# EAGLE schematic 6502_nes_book (EAGLE 6.4), part 2 of 5
## Sheet 8 of 29
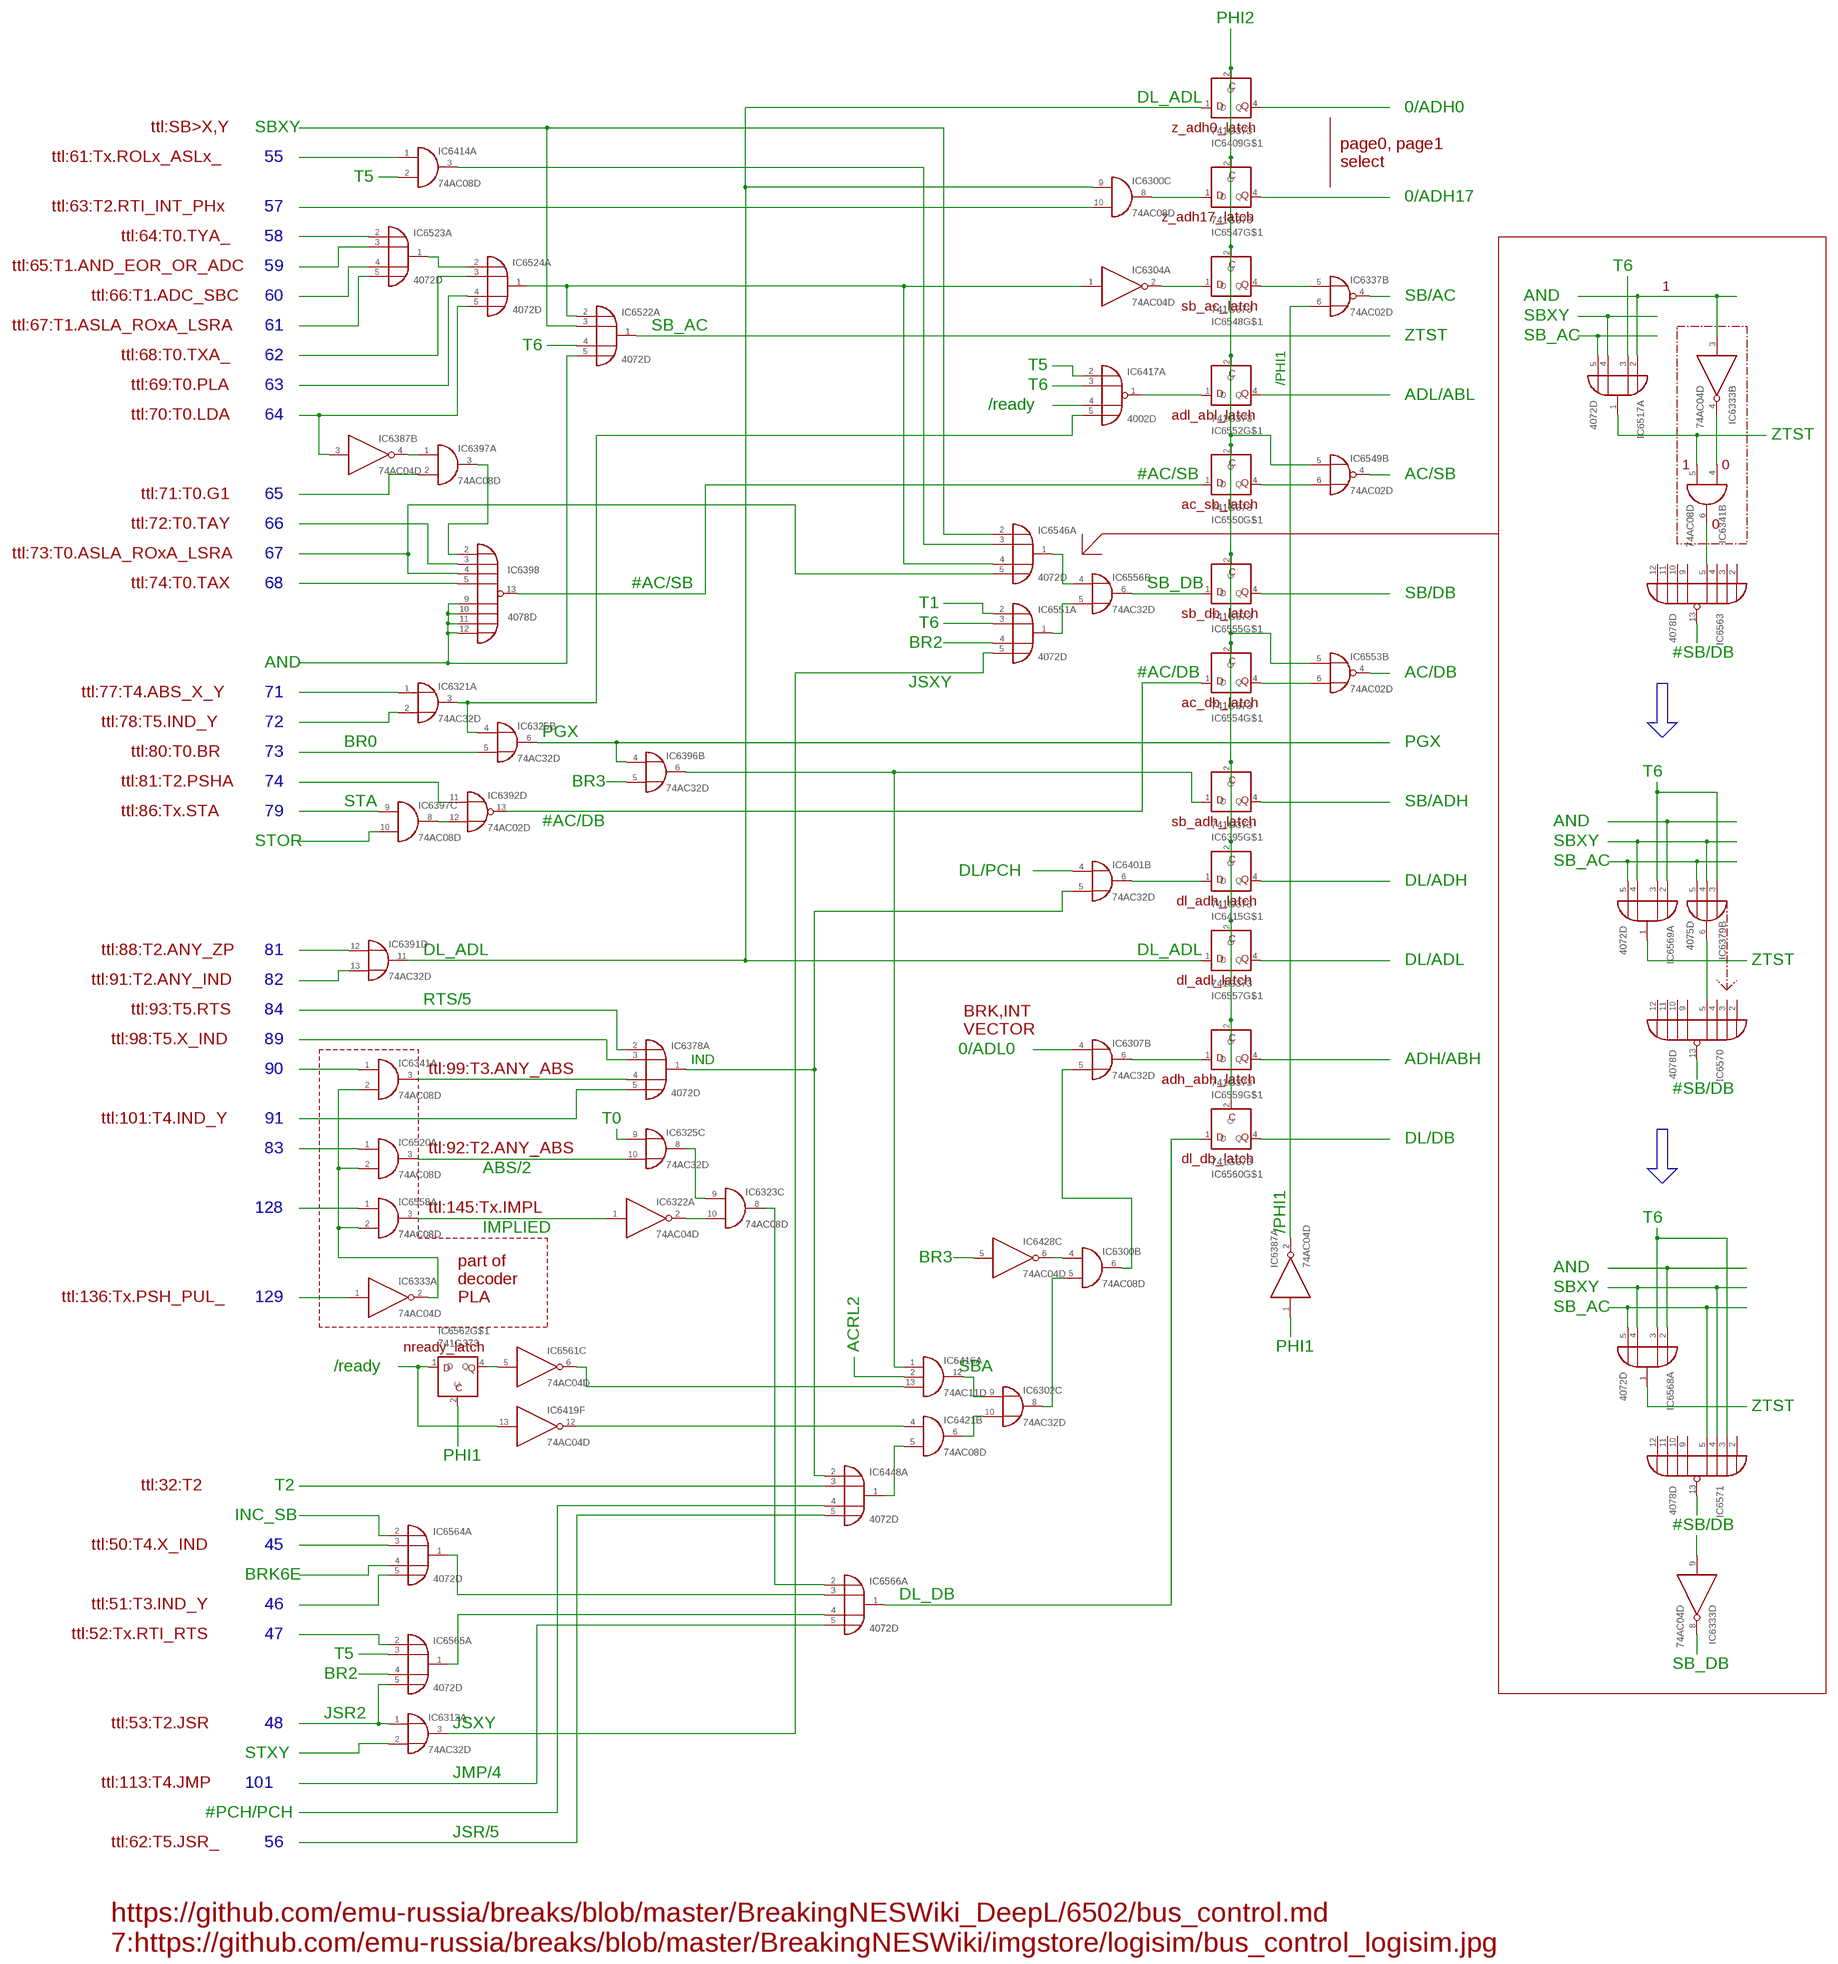
[diagram p8: schematic, sheet 8]

### Parts
IC6300  74AC08D  [SO14]
IC6302  74AC32D  [SO14]
IC6304  74AC04D  [SO14]
IC6307  74AC32D  [SO14]
IC6312  74AC32D  [SO14]
IC6321  74AC32D  [SO14]
IC6322  74AC04D  [SO14]
IC6323  74AC08D  [SO14]
IC6325  74AC32D  [SO14]
IC6333  74AC04D  [SO14]
IC6337  74AC02D  [SO14]
IC6341  74AC08D  [SO14]
IC6378  4072D  [SO14]
IC6379  4075D  [SO14]
IC6387  74AC04D  [SO14]
IC6391  74AC32D  [SO14]
IC6392  74AC02D  [SO14]
IC6395  741G373  [DBV-R-PDSO-G5]
IC6396  74AC32D  [SO14]
IC6397  74AC08D  [SO14]
IC6398  4078D  [SO14]
IC6401  74AC32D  [SO14]
IC6409  741G373  [DBV-R-PDSO-G5]
IC6414  74AC08D  [SO14]
IC6415  741G373  [DBV-R-PDSO-G5]
IC6416  74AC11D  [SO14]
IC6417  4002D  [SO14]
IC6419  74AC04D  [SO14]
IC6421  74AC08D  [SO14]
IC6428  74AC04D  [SO14]
IC6448  4072D  [SO14]
IC6517  4072D  [SO14]
IC6520  74AC08D  [SO14]
IC6522  4072D  [SO14]
IC6523  4072D  [SO14]
IC6524  4072D  [SO14]
IC6546  4072D  [SO14]
IC6547  741G373  [DBV-R-PDSO-G5]
IC6548  741G373  [DBV-R-PDSO-G5]
IC6549  74AC02D  [SO14]
IC6550  741G373  [DBV-R-PDSO-G5]
IC6551  4072D  [SO14]
IC6552  741G373  [DBV-R-PDSO-G5]
IC6553  74AC02D  [SO14]
IC6554  741G373  [DBV-R-PDSO-G5]
IC6555  741G373  [DBV-R-PDSO-G5]
IC6556  74AC32D  [SO14]
IC6557  741G373  [DBV-R-PDSO-G5]
IC6558  74AC08D  [SO14]
IC6559  741G373  [DBV-R-PDSO-G5]
IC6560  741G373  [DBV-R-PDSO-G5]
IC6561  74AC04D  [SO14]
IC6562  741G373  [DBV-R-PDSO-G5]
IC6563  4078D  [SO14]
IC6564  4072D  [SO14]
IC6565  4072D  [SO14]
IC6566  4072D  [SO14]
IC6568  4072D  [SO14]
IC6569  4072D  [SO14]
IC6570  4078D  [SO14]
IC6571  4078D  [SO14]

### Nets
N$277: IC6337.6(B:I1) IC6387.2(A:O)
N$278: IC6387.1(A:I)
N$11245: IC6341.3(A:O) IC6378.4(A:I2)
N$11246: IC6378.5(A:I3)
N$11254: IC6333.3(B:I) IC6517.2(A:I0)
N$11278: IC6325.10(C:I1) IC6520.3(A:O)
N$11309: IC6323.8(C:O) IC6566.2(A:I0)
N$11310: IC6323.9(C:I0) IC6325.8(C:O)
N$11311: IC6325.9(C:I0)
N$11312: IC6322.1(A:I) IC6558.3(A:O)
N$11389: IC6523.5(A:I3)
N$11390: IC6523.2(A:I0)
N$11391: IC6524.4(A:I2)
N$11392: IC6524.3(A:I1)
N$11393: IC6387.3(B:I) IC6524.5(A:I3)
N$11394: IC6397.2(A:I1)
N$11395: IC6387.4(B:O) IC6397.1(A:I0)
N$11396: IC6398.5(I3)
N$11397: IC6398.4(I2) IC6546.5(A:I3)
N$11398: IC6398.3(I1)
N$11401: IC6321.2(A:I1)
N$11402: IC6321.1(A:I0)
N$11408: IC6523.4(A:I2)
N$11409: IC6523.3(A:I1)
N$11412: IC6304.1(A:I) IC6522.2(A:I0) IC6524.1(A:O) IC6546.4(A:I2)
N$11413: IC6398.13(J) IC6550.1(D)
N$11414: IC6321.3(A:O) IC6325.4(B:I0) IC6417.5(A:I3)
N$11416: IC6414.1(A:I0)
N$11417: IC6300.10(C:I1)
N$11418: IC6414.3(A:O) IC6546.3(A:I1)
N$11419: IC6300.8(C:O) IC6547.1(D)
N$11420: IC6300.9(C:I0) IC6391.11(D:O) IC6409.1(D) IC6557.1(D)
N$11423: IC6417.2(A:I0)
N$11424: IC6392.13(D:O) IC6554.1(D)
N$11425: IC6392.11(D:I0)
N$11426: IC6397.9(C:I0)
N$11427: IC6395.4(Q)
N$11428: IC6396.5(B:I1)
N$11432: IC6417.3(A:I1)
N$11449: IC6401.6(B:O) IC6415.1(D)
N$11450: IC6522.4(A:I2)
N$11451: IC6409.4(Q)
N$11456: IC6302.9(C:I0) IC6416.12(A:O)
N$11457: IC6378.2(A:I0)
N$11469: IC6401.4(B:I0)
N$11470: IC6378.1(A:O) IC6401.5(B:I1) IC6448.2(A:I0)
N$11478: IC6391.12(D:I0)
N$11479: IC6391.13(D:I1)
N$11483: IC6397.3(A:O) IC6398.2(I0)
N$11485: IC6392.12(D:I1) IC6397.8(C:O)
N$11489: IC6395.1(D) IC6396.6(B:O) IC6416.1(A:I0)
N$11507: IC6517.4(A:I2)
N$11511: IC6312.3(A:O) IC6551.5(A:I3)
N$11529: IC6448.3(A:I1)
N$11533: IC6302.10(C:I1) IC6421.6(B:O)
N$11534: IC6300.4(B:I0) IC6428.6(C:O)
N$11558: IC6419.12(F:O) IC6421.4(B:I0)
N$11564: IC6421.5(B:I1) IC6448.1(A:O)
N$11568: IC6419.13(F:I) IC6562.1(D)
N$11693: IC6307.6(B:O) IC6559.1(D)
N$11694: IC6300.5(B:I1) IC6302.8(C:O)
N$11717: IC6322.2(A:O) IC6323.10(C:I1)
N$11722: IC6517.5(A:I3)
N$11726: IC6300.6(B:O) IC6307.5(B:I1)
N$11728: IC6341.1(A:I0)
N$11733: IC6304.2(A:O) IC6548.1(D)
N$11734: IC6523.1(A:O) IC6524.2(A:I0)
N$11736: IC6378.3(A:I1)
N$11737: IC6520.1(A:I0)
N$11742: IC6312.1(A:I0) IC6565.5(A:I3)
N$11751: IC6448.5(A:I3)
N$11762: IC6307.4(B:I0)
N$11768: IC6517.3(A:I1)
N$11785: IC6337.5(B:I0) IC6548.4(Q)
N$11809: IC6325.5(B:I1)
N$11824: IC6341.5(B:I1) IC6517.1(A:O)
N$11833: IC6546.1(A:O) IC6556.4(B:I0)
N$11834: IC6547.4(Q)
N$11835: IC6414.2(A:I1)
N$11836: IC6557.4(Q)
N$11837: IC6312.2(A:I1)
N$11838: IC6415.4(Q)
N$11839: IC6337.4(B:O)
N$11840: IC6522.3(A:I1) IC6546.2(A:I0)
N$11841: IC6395.2(C) IC6409.2(C) IC6415.2(C) IC6547.2(C) IC6548.2(C) IC6549.5(B:I0) IC6550.2(C) IC6552.2(C) IC6553.5(B:I0) IC6554.2(C) IC6555.2(C) IC6557.2(C) IC6559.2(C) IC6560.2(C)
N$11842: IC6522.1(A:O)
N$11843: IC6549.6(B:I1) IC6550.4(Q)
N$11844: IC6549.4(B:O)
N$11845: IC6398.9(I4) IC6398.10(I5) IC6398.11(I6) IC6398.12(I7) IC6522.5(A:I3)
N$11846: IC6417.1(A:O) IC6552.1(D)
N$11847: IC6551.1(A:O) IC6556.5(B:I1)
N$11848: IC6552.4(Q)
N$11849: IC6417.4(A:I2)
N$11850: IC6325.6(B:O) IC6396.4(B:I0)
N$11851: IC6397.10(C:I1)
N$11852: IC6555.4(Q)
N$11853: IC6553.6(B:I1) IC6554.4(Q)
N$11854: IC6553.4(B:O)
N$11855: IC6555.1(D) IC6556.6(B:O)
N$11856: IC6551.4(A:I2)
N$11857: IC6551.3(A:I1)
N$11858: IC6551.2(A:I0)
N$11859: IC6333.2(A:O) IC6341.2(A:I1) IC6520.2(A:I1) IC6558.2(A:I1)
N$11860: IC6333.1(A:I)
N$11861: IC6558.1(A:I0)
N$11862: IC6559.4(Q)
N$11863: IC6560.4(Q)
N$11864: IC6428.5(C:I)
N$11865: IC6562.2(C)
N$11866: IC6448.4(A:I2)
N$11867: IC6416.13(A:I2) IC6561.6(C:O)
N$11868: IC6561.5(C:I) IC6562.4(Q)
N$11869: IC6416.2(A:I1)
N$11871: IC6333.4(B:O) IC6341.4(B:I0)
N$11872: IC6341.6(B:O) IC6563.5(I3)
N$11873: IC6563.13(J)
N$11874: IC6569.2(A:I0)
N$11875: IC6379.4(B:I1) IC6569.4(A:I2)
N$11876: IC6379.5(B:I2) IC6569.5(A:I3)
N$11877: IC6564.2(A:I0)
N$11878: IC6564.5(A:I3)
N$11879: IC6564.4(A:I2)
N$11880: IC6564.3(A:I1)
N$11882: IC6565.2(A:I0)
N$11883: IC6565.3(A:I1)
N$11884: IC6565.4(A:I2)
N$11885: IC6566.5(A:I3)
N$11886: IC6565.1(A:O) IC6566.4(A:I2)
N$11887: IC6564.1(A:O) IC6566.3(A:I1)
N$11888: IC6379.3(B:I0) IC6569.3(A:I1)
N$11889: IC6560.1(D) IC6566.1(A:O)
N$11890: IC6569.1(A:O)
N$11891: IC6568.2(A:I0)
N$11892: IC6379.6(B:O) IC6570.5(I3)
N$11893: IC6570.13(J)
N$11894: IC6568.4(A:I2) IC6571.4(I2)
N$11895: IC6568.5(A:I3) IC6571.5(I3)
N$11896: IC6568.3(A:I1) IC6571.3(I1)
N$11897: IC6568.1(A:O)
N$11898: IC6333.8(D:O)
N$11899: IC6571.13(J)
N$11900: IC6333.9(D:I)
Unconnected: IC6300.1(A:I0) IC6300.2(A:I1) IC6300.3(A:O) IC6300.11(D:O) IC6300.12(D:I0) IC6300.13(D:I1) IC6302.1(A:I0) IC6302.2(A:I1) IC6302.3(A:O) IC6302.4(B:I0) IC6302.5(B:I1) IC6302.6(B:O) IC6302.11(D:O) IC6302.12(D:I0) IC6302.13(D:I1) IC6304.3(B:I) IC6304.4(B:O) IC6304.5(C:I) IC6304.6(C:O) IC6304.8(D:O) IC6304.9(D:I) IC6304.10(E:O) IC6304.11(E:I) IC6304.12(F:O) IC6304.13(F:I) IC6307.1(A:I0) IC6307.2(A:I1) IC6307.3(A:O) IC6307.8(C:O) IC6307.9(C:I0) IC6307.10(C:I1) IC6307.11(D:O) IC6307.12(D:I0) IC6307.13(D:I1) IC6312.4(B:I0) IC6312.5(B:I1) IC6312.6(B:O) IC6312.8(C:O) IC6312.9(C:I0) IC6312.10(C:I1) IC6312.11(D:O) IC6312.12(D:I0) IC6312.13(D:I1) IC6321.4(B:I0) IC6321.5(B:I1) IC6321.6(B:O) IC6321.8(C:O) IC6321.9(C:I0) IC6321.10(C:I1) IC6321.11(D:O) IC6321.12(D:I0) IC6321.13(D:I1) IC6322.3(B:I) IC6322.4(B:O) IC6322.5(C:I) IC6322.6(C:O) IC6322.8(D:O) IC6322.9(D:I) IC6322.10(E:O) IC6322.11(E:I) IC6322.12(F:O) IC6322.13(F:I) IC6323.1(A:I0) IC6323.2(A:I1) IC6323.3(A:O) IC6323.4(B:I0) IC6323.5(B:I1) IC6323.6(B:O) IC6323.11(D:O) IC6323.12(D:I0) IC6323.13(D:I1) IC6325.1(A:I0) IC6325.2(A:I1) IC6325.3(A:O) IC6325.11(D:O) IC6325.12(D:I0) IC6325.13(D:I1) IC6333.5(C:I) IC6333.6(C:O) IC6333.10(E:O) IC6333.11(E:I) IC6333.12(F:O) IC6333.13(F:I) IC6337.1(A:O) IC6337.2(A:I0) IC6337.3(A:I1) IC6337.8(C:I0) IC6337.9(C:I1) IC6337.10(C:O) IC6337.11(D:I0) IC6337.12(D:I1) IC6337.13(D:O) IC6341.8(C:O) IC6341.9(C:I0) IC6341.10(C:I1) IC6341.11(D:O) IC6341.12(D:I0) IC6341.13(D:I1) IC6378.9(B:I0) IC6378.10(B:I1) IC6378.11(B:I2) IC6378.12(B:I3) IC6378.13(B:O) IC6379.1(A:I0) IC6379.2(A:I1) IC6379.8(A:I2) IC6379.9(A:O) IC6379.10(C:O) IC6379.11(C:I0) IC6379.12(C:I1) IC6379.13(C:I2) IC6387.5(C:I) IC6387.6(C:O) IC6387.8(D:O) IC6387.9(D:I) IC6387.10(E:O) IC6387.11(E:I) IC6387.12(F:O) IC6387.13(F:I) IC6391.1(A:I0) IC6391.2(A:I1) IC6391.3(A:O) IC6391.4(B:I0) IC6391.5(B:I1) IC6391.6(B:O) IC6391.8(C:O) IC6391.9(C:I0) IC6391.10(C:I1) IC6392.1(A:O) IC6392.2(A:I0) IC6392.3(A:I1) IC6392.4(B:O) IC6392.5(B:I0) IC6392.6(B:I1) IC6392.8(C:I0) IC6392.9(C:I1) IC6392.10(C:O) IC6396.1(A:I0) IC6396.2(A:I1) IC6396.3(A:O) IC6396.8(C:O) IC6396.9(C:I0) IC6396.10(C:I1) IC6396.11(D:O) IC6396.12(D:I0) IC6396.13(D:I1) IC6397.4(B:I0) IC6397.5(B:I1) IC6397.6(B:O) IC6397.11(D:O) IC6397.12(D:I0) IC6397.13(D:I1) IC6401.1(A:I0) IC6401.2(A:I1) IC6401.3(A:O) IC6401.8(C:O) IC6401.9(C:I0) IC6401.10(C:I1) IC6401.11(D:O) IC6401.12(D:I0) IC6401.13(D:I1) IC6414.4(B:I0) IC6414.5(B:I1) IC6414.6(B:O) IC6414.8(C:O) IC6414.9(C:I0) IC6414.10(C:I1) IC6414.11(D:O) IC6414.12(D:I0) IC6414.13(D:I1) IC6416.3(B:I0) IC6416.4(B:I1) IC6416.5(B:I2) IC6416.6(B:O) IC6416.8(C:O) IC6416.9(C:I0) IC6416.10(C:I1) IC6416.11(C:I2) IC6417.9(B:I0) IC6417.10(B:I1) IC6417.11(B:I2) IC6417.12(B:I3) IC6417.13(B:O) IC6419.1(A:I) IC6419.2(A:O) IC6419.3(B:I) IC6419.4(B:O) IC6419.5(C:I) IC6419.6(C:O) IC6419.8(D:O) IC6419.9(D:I) IC6419.10(E:O) IC6419.11(E:I) IC6421.1(A:I0) IC6421.2(A:I1) IC6421.3(A:O) IC6421.8(C:O) IC6421.9(C:I0) IC6421.10(C:I1) IC6421.11(D:O) IC6421.12(D:I0) IC6421.13(D:I1) IC6428.1(A:I) IC6428.2(A:O) IC6428.3(B:I) IC6428.4(B:O) IC6428.8(D:O) IC6428.9(D:I) IC6428.10(E:O) IC6428.11(E:I) IC6428.12(F:O) IC6428.13(F:I) IC6448.9(B:I0) IC6448.10(B:I1) IC6448.11(B:I2) IC6448.12(B:I3) IC6448.13(B:O) IC6517.9(B:I0) IC6517.10(B:I1) IC6517.11(B:I2) IC6517.12(B:I3) IC6517.13(B:O) IC6520.4(B:I0) IC6520.5(B:I1) IC6520.6(B:O) IC6520.8(C:O) IC6520.9(C:I0) IC6520.10(C:I1) IC6520.11(D:O) IC6520.12(D:I0) IC6520.13(D:I1) IC6522.9(B:I0) IC6522.10(B:I1) IC6522.11(B:I2) IC6522.12(B:I3) IC6522.13(B:O) IC6523.9(B:I0) IC6523.10(B:I1) IC6523.11(B:I2) IC6523.12(B:I3) IC6523.13(B:O) IC6524.9(B:I0) IC6524.10(B:I1) IC6524.11(B:I2) IC6524.12(B:I3) IC6524.13(B:O) IC6546.9(B:I0) IC6546.10(B:I1) IC6546.11(B:I2) IC6546.12(B:I3) IC6546.13(B:O) IC6549.1(A:O) IC6549.2(A:I0) IC6549.3(A:I1) IC6549.8(C:I0) IC6549.9(C:I1) IC6549.10(C:O) IC6549.11(D:I0) IC6549.12(D:I1) IC6549.13(D:O) IC6551.9(B:I0) IC6551.10(B:I1) IC6551.11(B:I2) IC6551.12(B:I3) IC6551.13(B:O) IC6553.1(A:O) IC6553.2(A:I0) IC6553.3(A:I1) IC6553.8(C:I0) IC6553.9(C:I1) IC6553.10(C:O) IC6553.11(D:I0) IC6553.12(D:I1) IC6553.13(D:O) IC6556.1(A:I0) IC6556.2(A:I1) IC6556.3(A:O) IC6556.8(C:O) IC6556.9(C:I0) IC6556.10(C:I1) IC6556.11(D:O) IC6556.12(D:I0) IC6556.13(D:I1) IC6558.4(B:I0) IC6558.5(B:I1) IC6558.6(B:O) IC6558.8(C:O) IC6558.9(C:I0) IC6558.10(C:I1) IC6558.11(D:O) IC6558.12(D:I0) IC6558.13(D:I1) IC6561.1(A:I) IC6561.2(A:O) IC6561.3(B:I) IC6561.4(B:O) IC6561.8(D:O) IC6561.9(D:I) IC6561.10(E:O) IC6561.11(E:I) IC6561.12(F:O) IC6561.13(F:I) IC6563.2(I0) IC6563.3(I1) IC6563.4(I2) IC6563.9(I4) IC6563.10(I5) IC6563.11(I6) IC6563.12(I7) IC6564.9(B:I0) IC6564.10(B:I1) IC6564.11(B:I2) IC6564.12(B:I3) IC6564.13(B:O) IC6565.9(B:I0) IC6565.10(B:I1) IC6565.11(B:I2) IC6565.12(B:I3) IC6565.13(B:O) IC6566.9(B:I0) IC6566.10(B:I1) IC6566.11(B:I2) IC6566.12(B:I3) IC6566.13(B:O) IC6568.9(B:I0) IC6568.10(B:I1) IC6568.11(B:I2) IC6568.12(B:I3) IC6568.13(B:O) IC6569.9(B:I0) IC6569.10(B:I1) IC6569.11(B:I2) IC6569.12(B:I3) IC6569.13(B:O) IC6570.2(I0) IC6570.3(I1) IC6570.4(I2) IC6570.9(I4) IC6570.10(I5) IC6570.11(I6) IC6570.12(I7) IC6571.2(I0) IC6571.9(I4) IC6571.10(I5) IC6571.11(I6) IC6571.12(I7)

### Buses
B$12

### Notes on the sheet
- PHI2
- DL_ADL
- 0/ADH0
- ttl:SB>X,Y | SBXY | z_adh0_latch
- ttl:61:Tx.ROLx_ASLx_ | 55
- page0, page1 
  select
- T5
- 0/ADH17
- ttl:63:T2.RTI_INT_PHx | 57
- z_adh17_latch
- ttl:64:T0.TYA_ | 58
- ttl:65:T1.AND_EOR_OR_ADC | 59 | T6
- 1
- ttl:66:T1.ADC_SBC | 60 | SB/AC | AND
- sb_ac_latch
- SBXY
- ttl:67:T1.ASLA_ROxA_LSRA | 61 | SB_AC
- ZTST | SB_AC
- T6
- ttl:68:T0.TXA_ | 62
- T5
- /PHI1
- ttl:69:T0.PLA | 63 | T6
- ADL/ABL
- /ready
- ttl:70:T0.LDA | 64 | adl_abl_latch
- ZTST
- 1 | 0
- #AC/SB | AC/SB
- ttl:71:T0.G1 | 65
- ac_sb_latch
- ttl:72:T0.TAY | 66 | 0
- ttl:73:T0.ASLA_ROxA_LSRA | 67
- ttl:74:T0.TAX | 68 | #AC/SB | SB_DB
- SB/DB
- T1
- sb_db_latch
- T6
- BR2
- #SB/DB
- AND
- #AC/DB | AC/DB
- JSXY
- ttl:77:T4.ABS_X_Y | 71
- ac_db_latch
- ttl:78:T5.IND_Y | 72
- PGX
- BR0 | PGX
- ttl:80:T0.BR | 73
- T6
- ttl:81:T2.PSHA | 74 | BR3
- STA | SB/ADH
- ttl:86:Tx.STA | 79
- #AC/DB | sb_adh_latch | AND
- STOR | SBXY
- SB_AC
- DL/PCH
- DL/ADH
- dl_adh_latch
- ttl:88:T2.ANY_ZP | 81 | DL_ADL | DL_ADL
- DL/ADL | ZTST
- ttl:91:T2.ANY_IND | 82 | dl_adl_latch
- RTS/5
- ttl:93:T5.RTS | 84
- BRK,INT
  VECTOR
- ttl:98:T5.X_IND | 89
- 0/ADL0
- IND | ADH/ABH
- 90 | ttl:99:T3.ANY_ABS
- adh_abh_latch
- #SB/DB
- ttl:101:T4.IND_Y | 91 | T0
- DL/DB
- 83 | ttl:92:T2.ANY_ABS
- dl_db_latch
- ABS/2
- 128 | ttl:145:Tx.IMPL
- T6
- IMPLIED | /PHI1
- BR3
- AND
- SBXY
- ttl:136:Tx.PSH_PUL_ | 129
- part of
  decoder
  PLA
- SB_AC
- nready_latch | ACRL2 | PHI1
- /ready | SBA
- ZTST
- PHI1
- ttl:32:T2 | T2
- INC_SB
- #SB/DB
- ttl:50:T4.X_IND | 45
- BRK6E
- DL_DB
- ttl:51:T3.IND_Y | 46
- ttl:52:Tx.RTI_RTS | 47
- T5
- SB_DB
- BR2
- JSR2
- ttl:53:T2.JSR | 48 | JSXY
- STXY
- JMP/4
- ttl:113:T4.JMP | 101
- #PCH/PCH
- JSR/5
- ttl:62:T5.JSR_ | 56
- https://github.com/emu-russia/breaks/blob/master/BreakingNESWiki_DeepL/6502/bus_control.md
  7:https://github.com/emu-russia/breaks/blob/master/BreakingNESWiki/imgstore/logisim/bus_control_logisim.jpg

## Sheet 9 of 29
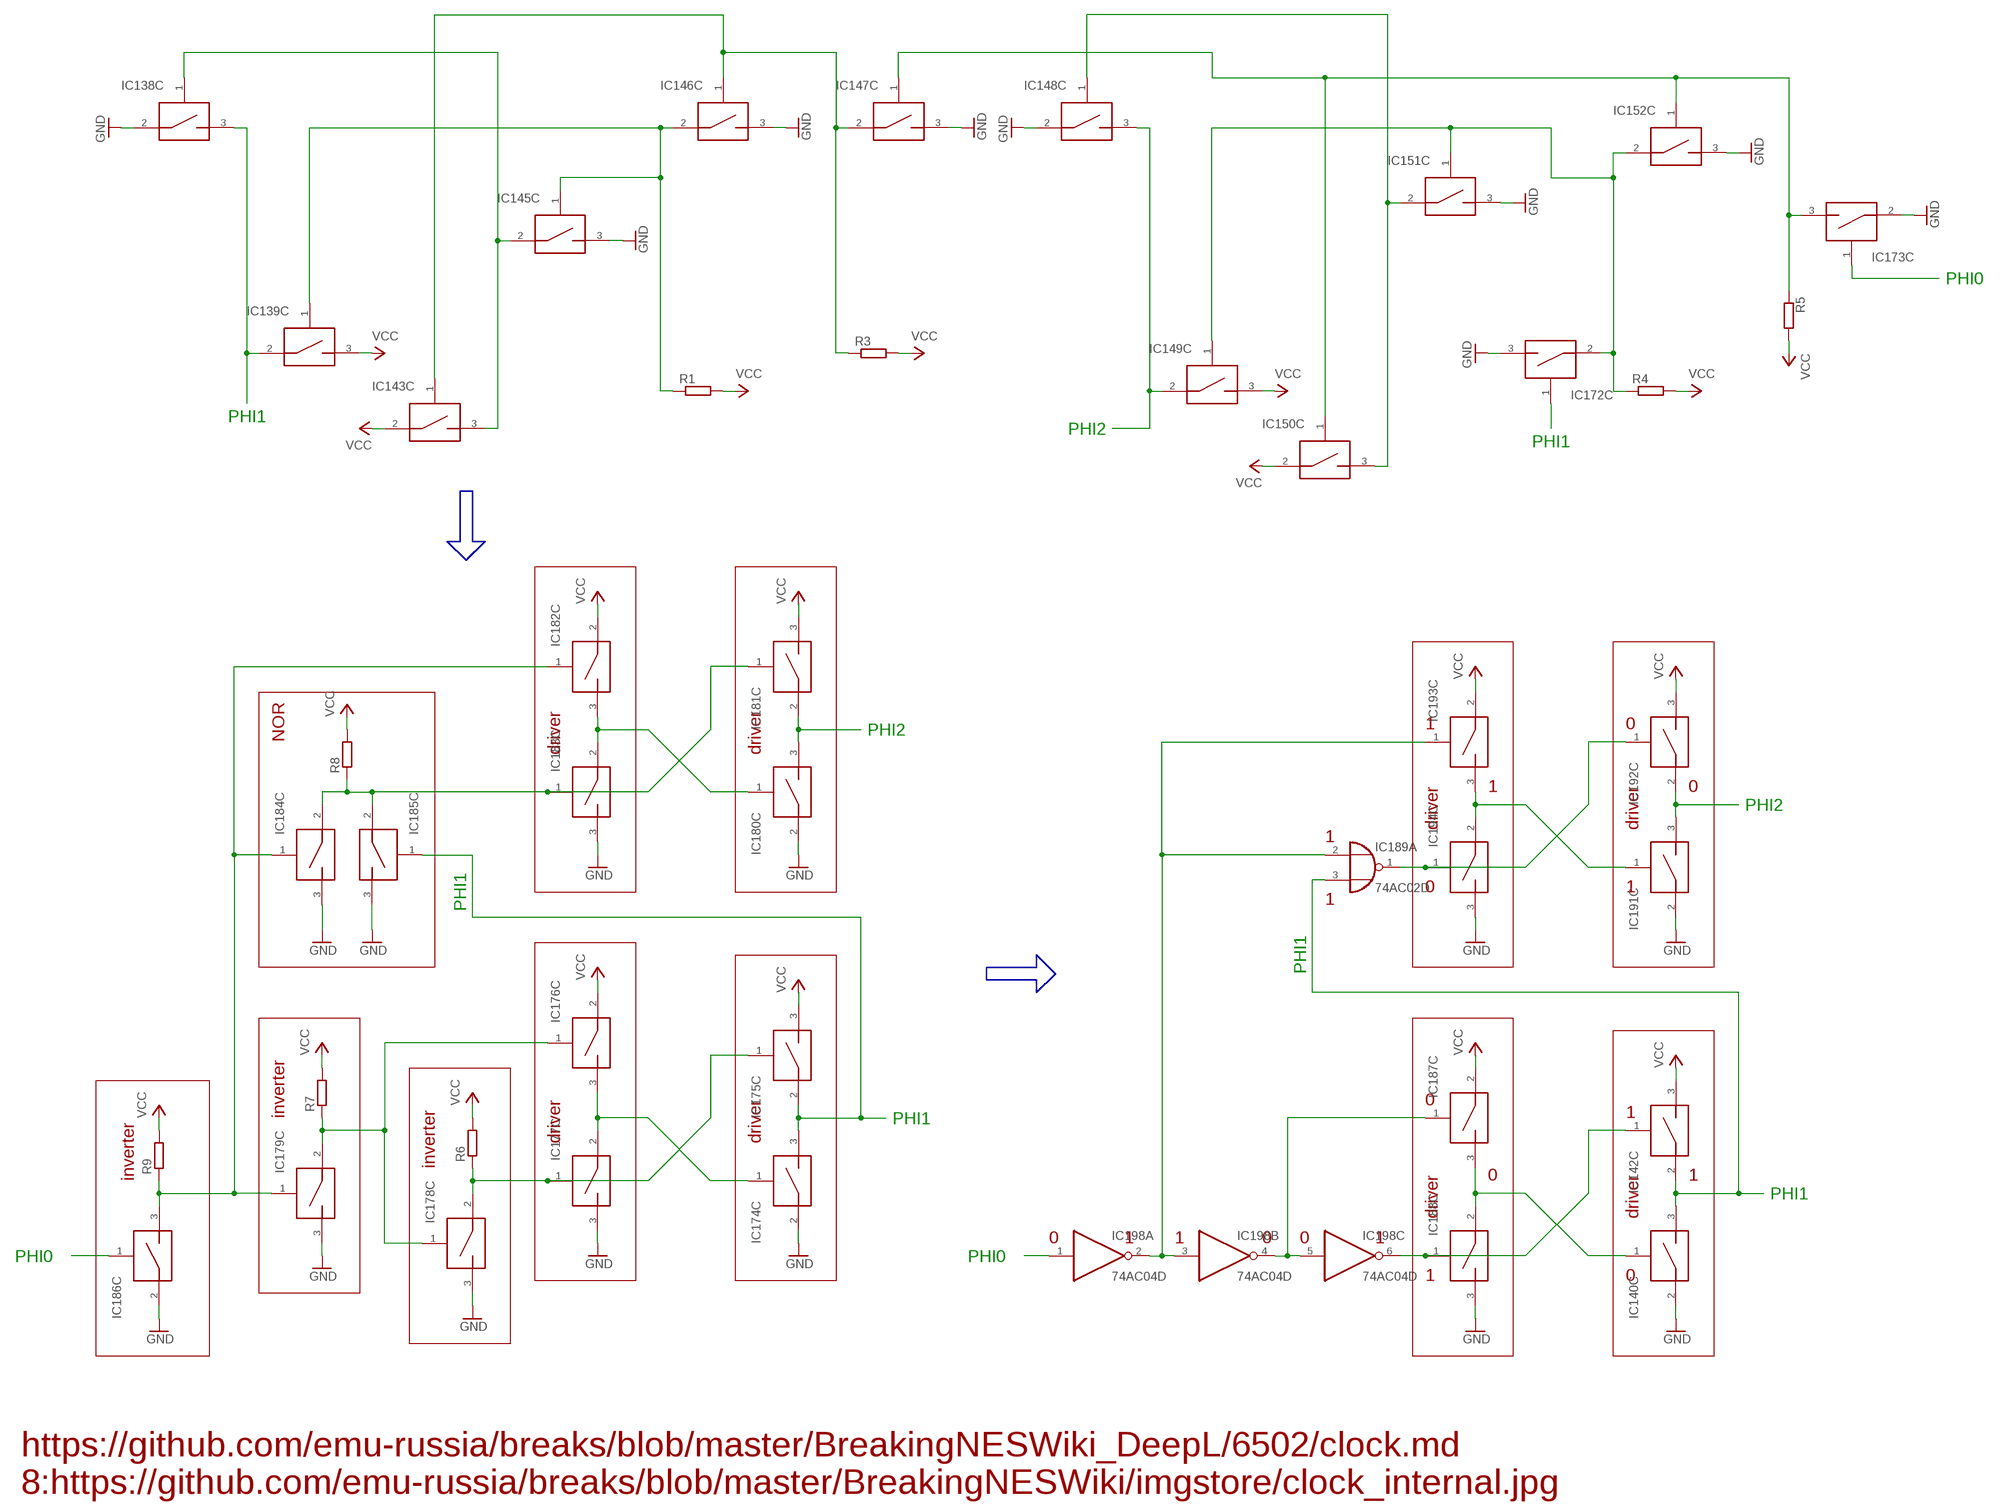
[diagram p9: schematic, sheet 9]

### Parts
IC138  MAX4613SO16  [SO16]
IC139  MAX4613SO16  [SO16]
IC140  MAX4613SO16  [SO16]
IC142  MAX4613SO16  [SO16]
IC143  MAX4613SO16  [SO16]
IC145  MAX4613SO16  [SO16]
IC146  MAX4613SO16  [SO16]
IC147  MAX4613SO16  [SO16]
IC148  MAX4613SO16  [SO16]
IC149  MAX4613SO16  [SO16]
IC150  MAX4613SO16  [SO16]
IC151  MAX4613SO16  [SO16]
IC152  MAX4613SO16  [SO16]
IC172  MAX4613SO16  [SO16]
IC173  MAX4613SO16  [SO16]
IC174  MAX4613SO16  [SO16]
IC175  MAX4613SO16  [SO16]
IC176  MAX4613SO16  [SO16]
IC177  MAX4613SO16  [SO16]
IC178  MAX4613SO16  [SO16]
IC179  MAX4613SO16  [SO16]
IC180  MAX4613SO16  [SO16]
IC181  MAX4613SO16  [SO16]
IC182  MAX4613SO16  [SO16]
IC183  MAX4613SO16  [SO16]
IC184  MAX4613SO16  [SO16]
IC185  MAX4613SO16  [SO16]
IC186  MAX4613SO16  [SO16]
IC187  MAX4613SO16  [SO16]
IC188  MAX4613SO16  [SO16]
IC189  74AC02D  [SO14]
IC191  MAX4613SO16  [SO16]
IC192  MAX4613SO16  [SO16]
IC193  MAX4613SO16  [SO16]
IC194  MAX4613SO16  [SO16]
IC198  74AC04D  [SO14]
R1  R-EU_R0603  [R0603]
R3  R-EU_R0603  [R0603]
R4  R-EU_R0603  [R0603]
R5  R-EU_R0603  [R0603]
R6  R-EU_R0603  [R0603]
R7  R-EU_R0603  [R0603]
R8  R-EU_R0603  [R0603]
R9  R-EU_R0603  [R0603]

### Nets
GND: IC138.2 IC140.2 IC145.3 IC146.3 IC147.3 IC148.2 IC151.3 IC152.3 IC172.3 IC173.2 IC174.2 IC177.3 IC178.3 IC179.3 IC180.2 IC183.3 IC184.3 IC185.3 IC186.2 IC188.3 IC191.2 IC194.3 ; also sheet 1,2,3,4,10,11,12,13,14,19,20,21,22,23
N$279: IC138.3 IC139.2
N$282: IC140.3 IC142.2 IC189.3(A:I1)
N$285: IC143.1 IC146.1 IC147.2 R3.1
N$286: IC138.1 IC143.3 IC145.2
N$288: IC187.1 IC198.4(B:O) IC198.5(C:I)
N$290: IC140.1 IC187.3 IC188.2
N$291: IC142.1 IC188.1 IC198.6(C:O)
N$292: IC189.2(A:I0) IC193.1 IC198.2(A:O) IC198.3(B:I)
N$294: IC139.1 IC145.1 IC146.2 R1.1
N$295: IC191.1 IC193.3 IC194.2
N$296: IC147.1 IC150.1 IC152.1 IC173.3 R5.1
N$297: IC148.1 IC150.3 IC151.2
N$298: IC148.3 IC149.2
N$299: IC149.1 IC151.1 IC152.2 IC172.2 R4.1
N$300: IC191.3 IC192.2
N$301: IC172.1
N$302: IC173.1
N$303: IC174.3 IC175.2 IC185.1
N$304: IC176.1 IC178.1 IC179.2 R7.1
N$305: IC174.1 IC176.3 IC177.2
N$306: IC175.1 IC177.1 IC178.2 R6.1
N$341: IC179.1 IC182.1 IC184.1 IC186.3 R9.1
N$342: IC180.1 IC182.3 IC183.2
N$343: IC180.3 IC181.2
N$344: IC181.1 IC183.1 IC184.2 IC185.2 R8.1
N$345: IC189.1(A:O) IC192.1 IC194.1
N$346: IC186.1
N$347: IC198.1(A:I)
VCC: IC139.3 IC142.3 IC143.2 IC149.3 IC150.2 IC175.3 IC176.2 IC181.3 IC182.2 IC187.2 IC192.3 IC193.2 R1.2 R3.2 R4.2 R5.2 R6.2 R7.2 R8.2 R9.2 ; also sheet 1,2,3,4,11,12,13,19,20,21,22,23,26
Unconnected: IC138.4(PWR:V-) IC138.5(PWR:GND) IC138.6 IC138.7 IC138.8 IC138.9 IC138.10 IC138.11 IC138.12(PWR:VCC) IC138.13(PWR:V+) IC138.14 IC138.15 IC138.16 IC139.4(PWR:V-) IC139.5(PWR:GND) IC139.6 IC139.7 IC139.8 IC139.9 IC139.10 IC139.11 IC139.12(PWR:VCC) IC139.13(PWR:V+) IC139.14 IC139.15 IC139.16 IC140.4(PWR:V-) IC140.5(PWR:GND) IC140.6 IC140.7 IC140.8 IC140.9 IC140.10 IC140.11 IC140.12(PWR:VCC) IC140.13(PWR:V+) IC140.14 IC140.15 IC140.16 IC142.4(PWR:V-) IC142.5(PWR:GND) IC142.6 IC142.7 IC142.8 IC142.9 IC142.10 IC142.11 IC142.12(PWR:VCC) IC142.13(PWR:V+) IC142.14 IC142.15 IC142.16 IC143.4(PWR:V-) IC143.5(PWR:GND) IC143.6 IC143.7 IC143.8 IC143.9 IC143.10 IC143.11 IC143.12(PWR:VCC) IC143.13(PWR:V+) IC143.14 IC143.15 IC143.16 IC145.4(PWR:V-) IC145.5(PWR:GND) IC145.6 IC145.7 IC145.8 IC145.9 IC145.10 IC145.11 IC145.12(PWR:VCC) IC145.13(PWR:V+) IC145.14 IC145.15 IC145.16 IC146.4(PWR:V-) IC146.5(PWR:GND) IC146.6 IC146.7 IC146.8 IC146.9 IC146.10 IC146.11 IC146.12(PWR:VCC) IC146.13(PWR:V+) IC146.14 IC146.15 IC146.16 IC147.4(PWR:V-) IC147.5(PWR:GND) IC147.6 IC147.7 IC147.8 IC147.9 IC147.10 IC147.11 IC147.12(PWR:VCC) IC147.13(PWR:V+) IC147.14 IC147.15 IC147.16 IC148.4(PWR:V-) IC148.5(PWR:GND) IC148.6 IC148.7 IC148.8 IC148.9 IC148.10 IC148.11 IC148.12(PWR:VCC) IC148.13(PWR:V+) IC148.14 IC148.15 IC148.16 IC149.4(PWR:V-) IC149.5(PWR:GND) IC149.6 IC149.7 IC149.8 IC149.9 IC149.10 IC149.11 IC149.12(PWR:VCC) IC149.13(PWR:V+) IC149.14 IC149.15 IC149.16 IC150.4(PWR:V-) IC150.5(PWR:GND) IC150.6 IC150.7 IC150.8 IC150.9 IC150.10 IC150.11 IC150.12(PWR:VCC) IC150.13(PWR:V+) IC150.14 IC150.15 IC150.16 IC151.4(PWR:V-) IC151.5(PWR:GND) IC151.6 IC151.7 IC151.8 IC151.9 IC151.10 IC151.11 IC151.12(PWR:VCC) IC151.13(PWR:V+) IC151.14 IC151.15 IC151.16 IC152.4(PWR:V-) IC152.5(PWR:GND) IC152.6 IC152.7 IC152.8 IC152.9 IC152.10 IC152.11 IC152.12(PWR:VCC) IC152.13(PWR:V+) IC152.14 IC152.15 IC152.16 IC172.4(PWR:V-) IC172.5(PWR:GND) IC172.6 IC172.7 IC172.8 IC172.9 IC172.10 IC172.11 IC172.12(PWR:VCC) IC172.13(PWR:V+) IC172.14 IC172.15 IC172.16 IC173.4(PWR:V-) IC173.5(PWR:GND) IC173.6 IC173.7 IC173.8 IC173.9 IC173.10 IC173.11 IC173.12(PWR:VCC) IC173.13(PWR:V+) IC173.14 IC173.15 IC173.16 IC174.4(PWR:V-) IC174.5(PWR:GND) IC174.6 IC174.7 IC174.8 IC174.9 IC174.10 IC174.11 IC174.12(PWR:VCC) IC174.13(PWR:V+) IC174.14 IC174.15 IC174.16 IC175.4(PWR:V-) IC175.5(PWR:GND) IC175.6 IC175.7 IC175.8 IC175.9 IC175.10 IC175.11 IC175.12(PWR:VCC) IC175.13(PWR:V+) IC175.14 IC175.15 IC175.16 IC176.4(PWR:V-) IC176.5(PWR:GND) IC176.6 IC176.7 IC176.8 IC176.9 IC176.10 IC176.11 IC176.12(PWR:VCC) IC176.13(PWR:V+) IC176.14 IC176.15 IC176.16 IC177.4(PWR:V-) IC177.5(PWR:GND) IC177.6 IC177.7 IC177.8 IC177.9 IC177.10 IC177.11 IC177.12(PWR:VCC) IC177.13(PWR:V+) IC177.14 IC177.15 IC177.16 IC178.4(PWR:V-) IC178.5(PWR:GND) IC178.6 IC178.7 IC178.8 IC178.9 IC178.10 IC178.11 IC178.12(PWR:VCC) IC178.13(PWR:V+) IC178.14 IC178.15 IC178.16 IC179.4(PWR:V-) IC179.5(PWR:GND) IC179.6 IC179.7 IC179.8 IC179.9 IC179.10 IC179.11 IC179.12(PWR:VCC) IC179.13(PWR:V+) IC179.14 IC179.15 IC179.16 IC180.4(PWR:V-) IC180.5(PWR:GND) IC180.6 IC180.7 IC180.8 IC180.9 IC180.10 IC180.11 IC180.12(PWR:VCC) IC180.13(PWR:V+) IC180.14 IC180.15 IC180.16 IC181.4(PWR:V-) IC181.5(PWR:GND) IC181.6 IC181.7 IC181.8 IC181.9 IC181.10 IC181.11 IC181.12(PWR:VCC) IC181.13(PWR:V+) IC181.14 IC181.15 IC181.16 IC182.4(PWR:V-) IC182.5(PWR:GND) IC182.6 IC182.7 IC182.8 IC182.9 IC182.10 IC182.11 IC182.12(PWR:VCC) IC182.13(PWR:V+) IC182.14 IC182.15 IC182.16 IC183.4(PWR:V-) IC183.5(PWR:GND) IC183.6 IC183.7 IC183.8 IC183.9 IC183.10 IC183.11 IC183.12(PWR:VCC) IC183.13(PWR:V+) IC183.14 IC183.15 IC183.16 IC184.4(PWR:V-) IC184.5(PWR:GND) IC184.6 IC184.7 IC184.8 IC184.9 IC184.10 IC184.11 IC184.12(PWR:VCC) IC184.13(PWR:V+) IC184.14 IC184.15 IC184.16 IC185.4(PWR:V-) IC185.5(PWR:GND) IC185.6 IC185.7 IC185.8 IC185.9 IC185.10 IC185.11 IC185.12(PWR:VCC) IC185.13(PWR:V+) IC185.14 IC185.15 IC185.16 IC186.4(PWR:V-) IC186.5(PWR:GND) IC186.6 IC186.7 IC186.8 IC186.9 IC186.10 IC186.11 IC186.12(PWR:VCC) IC186.13(PWR:V+) IC186.14 IC186.15 IC186.16 IC187.4(PWR:V-) IC187.5(PWR:GND) IC187.6 IC187.7 IC187.8 IC187.9 IC187.10 IC187.11 IC187.12(PWR:VCC) IC187.13(PWR:V+) IC187.14 IC187.15 IC187.16 IC188.4(PWR:V-) IC188.5(PWR:GND) IC188.6 IC188.7 IC188.8 IC188.9 IC188.10 IC188.11 IC188.12(PWR:VCC) IC188.13(PWR:V+) IC188.14 IC188.15 IC188.16 IC189.4(B:O) IC189.5(B:I0) IC189.6(B:I1) IC189.8(C:I0) IC189.9(C:I1) IC189.10(C:O) IC189.11(D:I0) IC189.12(D:I1) IC189.13(D:O) IC191.4(PWR:V-) IC191.5(PWR:GND) IC191.6 IC191.7 IC191.8 IC191.9 IC191.10 IC191.11 IC191.12(PWR:VCC) IC191.13(PWR:V+) IC191.14 IC191.15 IC191.16 IC192.4(PWR:V-) IC192.5(PWR:GND) IC192.6 IC192.7 IC192.8 IC192.9 IC192.10 IC192.11 IC192.12(PWR:VCC) IC192.13(PWR:V+) IC192.14 IC192.15 IC192.16 IC193.4(PWR:V-) IC193.5(PWR:GND) IC193.6 IC193.7 IC193.8 IC193.9 IC193.10 IC193.11 IC193.12(PWR:VCC) IC193.13(PWR:V+) IC193.14 IC193.15 IC193.16 IC194.4(PWR:V-) IC194.5(PWR:GND) IC194.6 IC194.7 IC194.8 IC194.9 IC194.10 IC194.11 IC194.12(PWR:VCC) IC194.13(PWR:V+) IC194.14 IC194.15 IC194.16 IC198.8(D:O) IC198.9(D:I) IC198.10(E:O) IC198.11(E:I) IC198.12(F:O) IC198.13(F:I)

### Buses
B$12

### Notes on the sheet
- PHI0
- PHI1
- PHI2
- PHI1
- 1 | 0
- PHI2
- NOR
- driver | driver
- 1 | 0
- PHI2
- driver | driver
- 1
- 0 | 1
- 1
- PHI1
- PHI1
- 0
- inverter | 1
- PHI1
- driver | driver
- inverter
- inverter | 0 | 1
- PHI1
- driver | driver
- 0 | 1 | 1 | 0 | 0 | 1
- PHI0 | PHI0
- 1 | 0
- https://github.com/emu-russia/breaks/blob/master/BreakingNESWiki_DeepL/6502/clock.md
  8:https://github.com/emu-russia/breaks/blob/master/BreakingNESWiki/imgstore/clock_internal.jpg

## Sheet 10 of 29
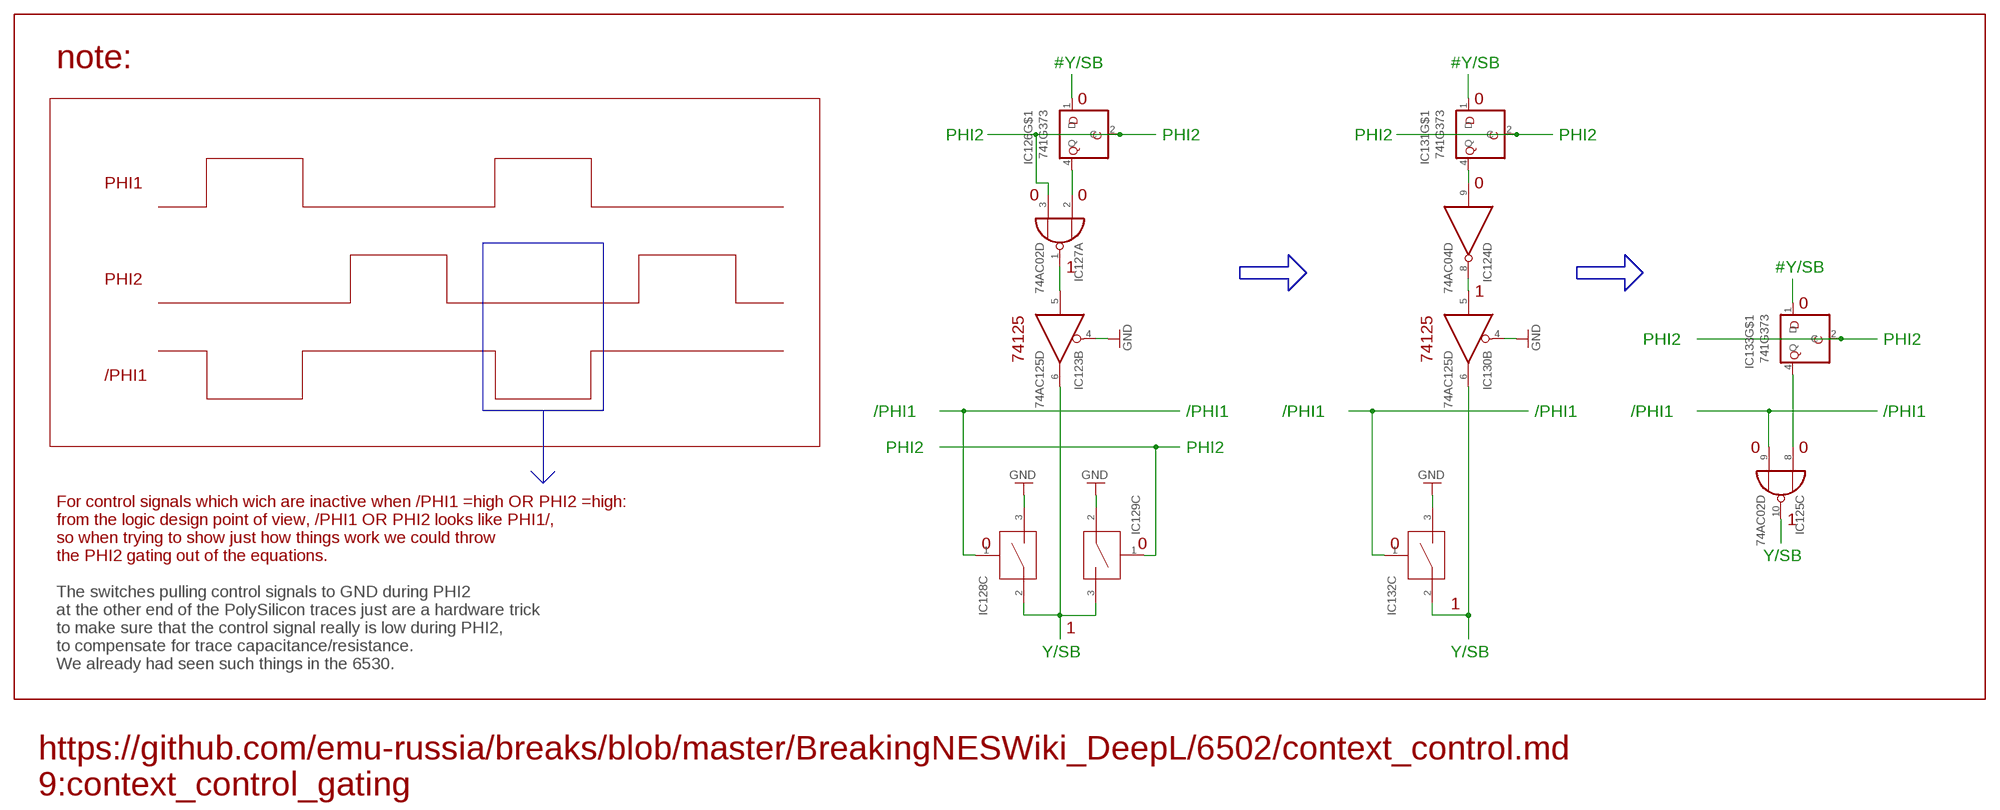
[diagram p10: schematic, sheet 10]

### Parts
IC123  74AC125D  [SO14]
IC124  74AC04D  [SO14]
IC125  74AC02D  [SO14]
IC126  741G373  [DBV-R-PDSO-G5]
IC127  74AC02D  [SO14]
IC128  MAX4613SO16  [SO16]
IC129  MAX4613SO16  [SO16]
IC130  74AC125D  [SO14]
IC131  741G373  [DBV-R-PDSO-G5]
IC132  MAX4613SO16  [SO16]
IC133  741G373  [DBV-R-PDSO-G5]

### Nets
GND: IC123.4(B:OE) IC128.3 IC129.2 IC130.4(B:OE) IC132.3 ; also sheet 1,2,3,4,9,11,12,13,14,19,20,21,22,23
N$245: IC126.2(C) IC127.3(A:I1)
N$246: IC126.1(D)
N$247: IC128.1
N$248: IC126.4(Q) IC127.2(A:I0)
N$249: IC123.5(B:I) IC127.1(A:O)
N$250: IC129.1
N$251: IC123.6(B:O) IC128.2 IC129.3
N$252: IC131.2(C)
N$253: IC131.1(D)
N$254: IC132.1
N$255: IC124.9(D:I) IC131.4(Q)
N$256: IC124.8(D:O) IC130.5(B:I)
N$257: IC130.6(B:O) IC132.2
N$258: IC133.2(C)
N$259: IC133.1(D)
N$260: IC125.9(C:I1)
N$261: IC125.10(C:O)
N$262: IC125.8(C:I0) IC133.4(Q)
Unconnected: IC123.1(A:OE) IC123.2(A:I) IC123.3(A:O) IC123.8(C:O) IC123.9(C:I) IC123.10(C:OE) IC123.11(D:O) IC123.12(D:I) IC123.13(D:OE) IC124.1(A:I) IC124.2(A:O) IC124.3(B:I) IC124.4(B:O) IC124.5(C:I) IC124.6(C:O) IC124.10(E:O) IC124.11(E:I) IC124.12(F:O) IC124.13(F:I) IC125.1(A:O) IC125.2(A:I0) IC125.3(A:I1) IC125.4(B:O) IC125.5(B:I0) IC125.6(B:I1) IC125.11(D:I0) IC125.12(D:I1) IC125.13(D:O) IC127.4(B:O) IC127.5(B:I0) IC127.6(B:I1) IC127.8(C:I0) IC127.9(C:I1) IC127.10(C:O) IC127.11(D:I0) IC127.12(D:I1) IC127.13(D:O) IC128.4(PWR:V-) IC128.5(PWR:GND) IC128.6 IC128.7 IC128.8 IC128.9 IC128.10 IC128.11 IC128.12(PWR:VCC) IC128.13(PWR:V+) IC128.14 IC128.15 IC128.16 IC129.4(PWR:V-) IC129.5(PWR:GND) IC129.6 IC129.7 IC129.8 IC129.9 IC129.10 IC129.11 IC129.12(PWR:VCC) IC129.13(PWR:V+) IC129.14 IC129.15 IC129.16 IC130.1(A:OE) IC130.2(A:I) IC130.3(A:O) IC130.8(C:O) IC130.9(C:I) IC130.10(C:OE) IC130.11(D:O) IC130.12(D:I) IC130.13(D:OE) IC132.4(PWR:V-) IC132.5(PWR:GND) IC132.6 IC132.7 IC132.8 IC132.9 IC132.10 IC132.11 IC132.12(PWR:VCC) IC132.13(PWR:V+) IC132.14 IC132.15 IC132.16

### Buses
B$12
B$1

### Notes on the sheet
- note: | #Y/SB | #Y/SB
- 0 | 0
- PHI2 | PHI2 | PHI2 | PHI2
- PHI1 | 0
- 0 | 0
- 1 | #Y/SB
- PHI2
- 1
- 0
- PHI2 | PHI2
- 74125 | 74125
- /PHI1
- /PHI1 | /PHI1 | /PHI1 | /PHI1 | /PHI1 | /PHI1
- PHI2 | PHI2 | 0 | 0
- 1
- 0 | 0 | 0
- For control signals which wich are inactive when /PHI1 =high OR PHI2 =high:
  from the logic design point of view, /PHI1 OR PHI2 looks like PHI1/,
  so when trying to show just how things work we could throw
  the PHI2 gating out of the equations.
- Y/SB
- 1
- 1
- Y/SB | Y/SB
- The switches pulling control signals to GND during PHI2
  at the other end of the PolySilicon traces just are a hardware trick
  to make sure that the control signal really is low during PHI2,
  to compensate for trace capacitance/resistance.
  We already had seen such things in the 6530.
- https://github.com/emu-russia/breaks/blob/master/BreakingNESWiki_DeepL/6502/context_control.md
  9:context_control_gating

## Sheet 11 of 29
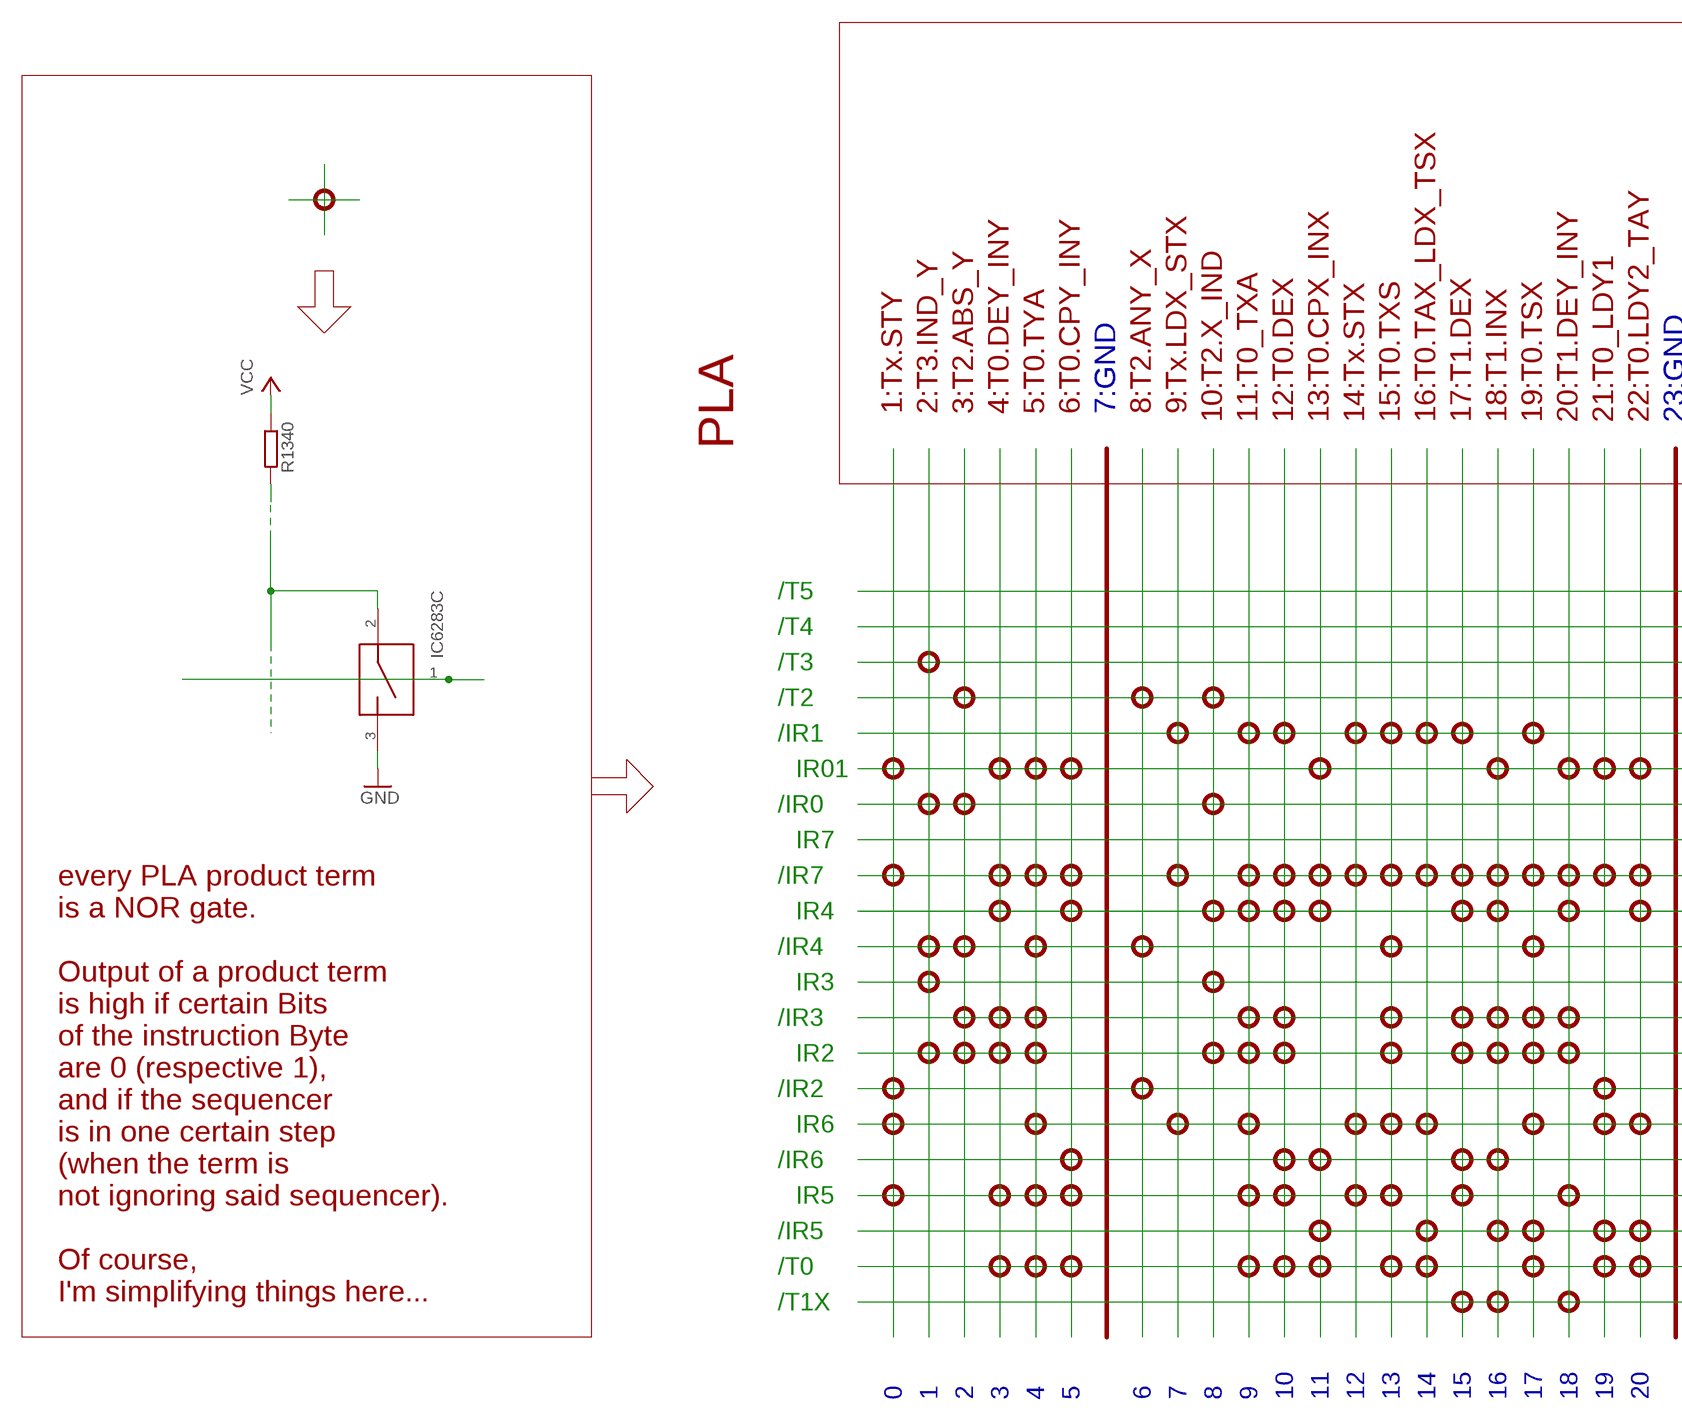
[diagram p11: schematic, sheet 11, part 1 of 2]
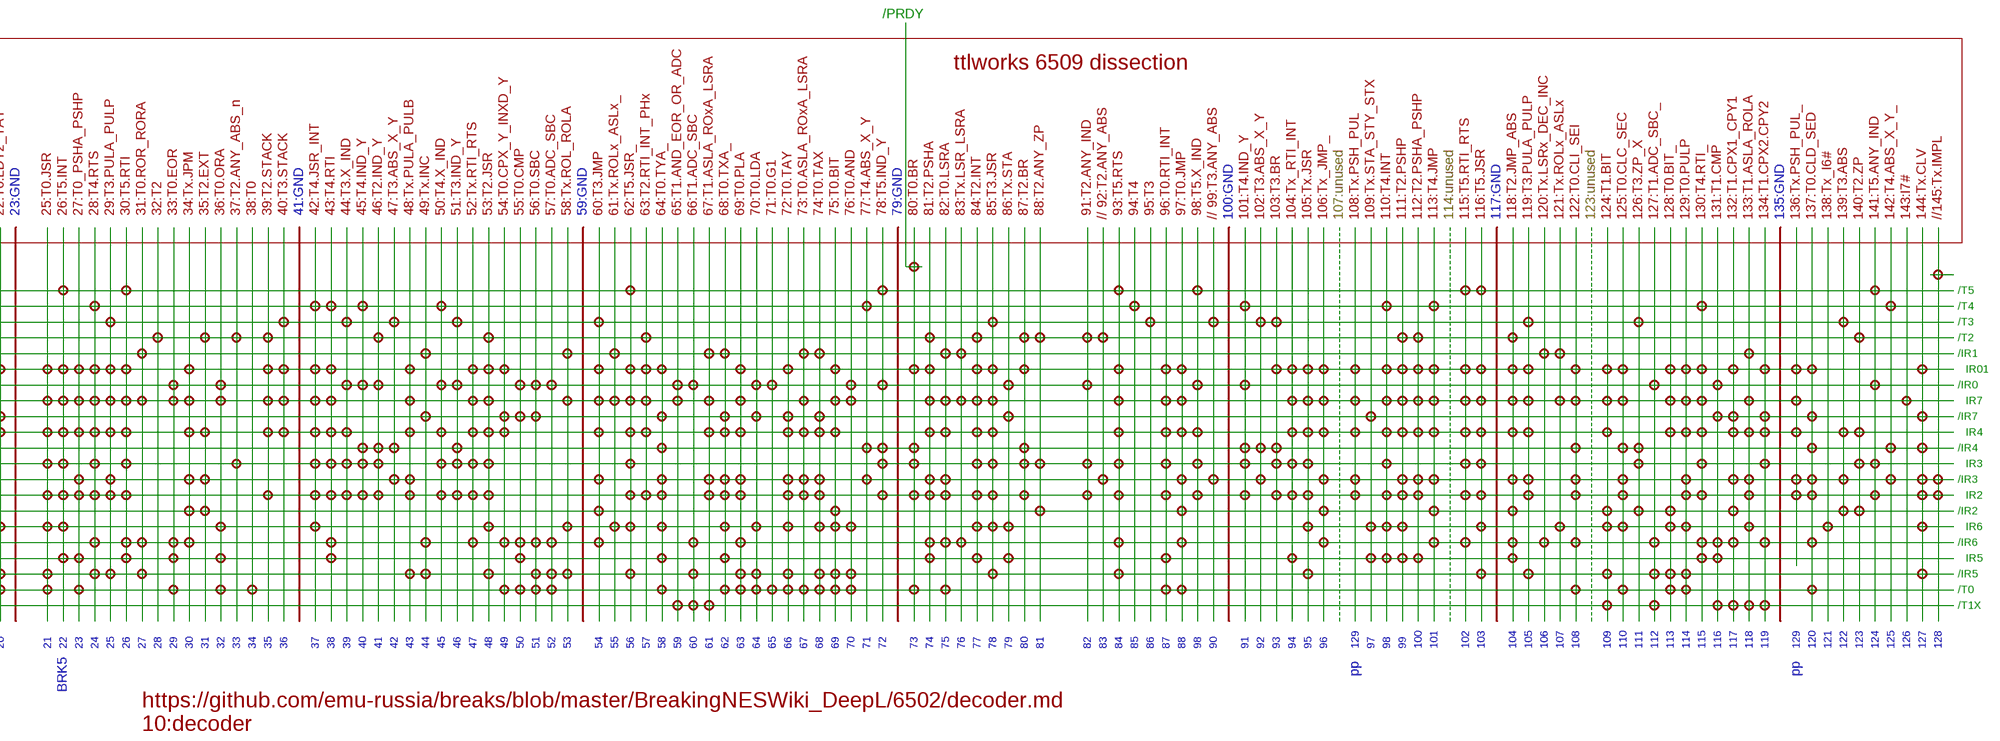
[diagram p12: schematic, sheet 11, part 2 of 2]

### Parts
IC6283  MAX4613SO16  [SO16]
R1340  R-EU_R0603  [R0603]

### Nets
GND: IC6283.3 ; also sheet 1,2,3,4,9,10,12,13,14,19,20,21,22,23
N$11229: IC6283.2 R1340.2
N$11231: IC6283.1
VCC: R1340.1 ; also sheet 1,2,3,4,9,12,13,19,20,21,22,23,26
Unconnected: IC6283.4(PWR:V-) IC6283.5(PWR:GND) IC6283.6 IC6283.7 IC6283.8 IC6283.9 IC6283.10 IC6283.11 IC6283.12(PWR:VCC) IC6283.13(PWR:V+) IC6283.14 IC6283.15 IC6283.16

### Notes on the sheet
- /PRDY
- ttlworks 6509 dissection
- 1:Tx.STY | 2:T3.IND_Y | 3:T2.ABS_Y | 4:T0.DEY_INY | 5:T0.TYA | 6:T0.CPY_INY | 7:GND | 8:T2.ANY_X | 9:Tx.LDX_STX | 10:T2.X_IND | 11:T0_TXA | 12:T0.DEX | 13:T0.CPX_INX | 14:Tx.STX | 15:T0.TXS | 16:T0.TAX_LDX_TSX | 17:T1.DEX | 18:T1.INX | 19:T0.TSX | 20:T1.DEY_INY | 21:T0_LDY1 | 22:T0.LDY2_TAY | 23:GND | 25:T0.JSR | 26:T5.INT | 27:T0_PSHA_PSHP | 28:T4.RTS | 29:T3.PULA_PULP | 30:T5.RTI | 31:T0.ROR_RORA | 32:T2 | 33:T0.EOR | 34:Tx.JPM | 35:T2.EXT | 36:T0.ORA | 37:T2.ANY_ABS_n | 38:T0 | 39:T2.STACK | 40:T3.STACK | 41:GND | 42:T4.JSR_INT | 43:T4.RTI | 44:T3.X_IND | 45:T4.IND_Y | 46:T2.IND_Y | 47:T3.ABS_X_Y | 48:Tx.PULA_PULB | 49:Tx.INC | 50:T4.X_IND | 51:T3.IND_Y | 52:Tx.RTI_RTS | 53:T2.JSR | 54:T0.CPX_Y_INXD_Y | 55:T0.CMP | 56:T0.SBC | 57:T0.ADC_SBC | 58:Tx.ROL_ROLA | 59:GND | 60:T3.JMP | 61:Tx.ROLx_ASLx_ | 62:T5.JSR_ | 63:T2.RTI_INT_PHx | 64:T0.TYA_ | 65:T1.AND_EOR_OR_ADC | 66:T1.ADC_SBC | 67:T1.ASLA_ROxA_LSRA | 68:T0.TXA_ | 69:T0.PLA | 70:T0.LDA | 71:T0.G1 | 72:T0.TAY | 73:T0.ASLA_ROxA_LSRA | 74:T0.TAX | 75:T0.BIT | 76:T0.AND | 77:T4.ABS_X_Y | 78:T5.IND_Y | 79:GND | 80:T0.BR | 81:T2.PSHA | 82:T0.LSRA | 83:Tx.LSR_LSRA | 84:T2.INT | 85:T3.JSR | 86:Tx.STA | 87:T2.BR | 88:T2.ANY_ZP | 91:T2.ANY_IND | // 92:T2.ANY_ABS | 93:T5.RTS | 94:T4 | 95:T3 | 96:T0.RTI_INT | 97:T0.JMP | 98:T5.X_IND | // 99:T3.ANY_ABS | 100:GND | 101:T4.IND_Y | 102:T3.ABS_X_Y | 103:T3.BR | 104:Tx_RTI_INT | 105:Tx.JSR | 106:Tx_JMP_ | 107:unused | 108:Tx.PSH_PUL | 109:Tx.STA_STY_STX | 110:T4.INT | 111:T2.PSHP | 112:T2.PSHA_PSHP | 113:T4.JMP | 114:unused | 115:T5.RTI_RTS | 116:T5.JSR | 117:GND | 118:T2.JMP_ABS | 119:T3.PULA_PULP | 120:Tx.LSRx_DEC_INC | 121:Tx.ROLx_ASLx | 122:T0.CLI_SEI | 123:unused | 124:T1.BIT | 125:T0.CLC_SEC | 126:T3.ZP_X | 127:T1.ADC_SBC_ | 128:T0.BIT_ | 129:T0.PULP | 130:T4.RTI_ | 131:T1.CMP | 132:T1.CPX1_CPY1 | 133:T1.ASLA_ROLA | 134:T1.CPX2.CPY2 | 135:GND | 136:Tx.PSH_PUL_ | 137:T0.CLD_SED | 138:Tx_I6# | 139:T3.ABS | 140:T2.ZP | 141:T5.ANY_IND | 142:T4.ABS_X_Y_ | 143:I7# | 144:Tx.CLV | //145:Tx.IMPL
- PLA
- /T5 | /T5
- /T4 | /T4
- /T3 | /T3
- /T2 | /T2
- /IR1 | /IR1
- IR01 | IR01
- /IR0 | /IR0
- IR7 | IR7
- /IR7 | /IR7
- IR4 | IR4
- /IR4 | /IR4
- IR3 | IR3
- /IR3 | /IR3
- IR2 | IR2
- /IR2 | /IR2
- IR6 | IR6
- /IR6 | /IR6
- IR5 | IR5
- /IR5 | /IR5
- /T0 | /T0
- every PLA product term
  is a NOR gate.
  
  Output of a product term
  is high if certain Bits
  of the instruction Byte
  are 0 (respective 1),
  and if the sequencer
  is in one certain step
  (when the term is
  not ignoring said sequencer).
  
  Of course,
  I'm simplifying things here...
- /T1X | /T1X
- 0 | 1 | 2 | 3 | 4 | 5 | 6 | 7 | 8 | 9 | 10 | 11 | 12 | 13 | 14 | 15 | 16 | 17 | 18 | 19 | 20 | 21 | 22 | 23 | 24 | 25 | 26 | 27 | 28 | 29 | 30 | 31 | 32 | 33 | 34 | 35 | 36 | 37 | 38 | 39 | 40 | 41 | 42 | 43 | 44 | 45 | 46 | 47 | 48 | 49 | 50 | 51 | 52 | 53 | 54 | 55 | 56 | 57 | 58 | 59 | 60 | 61 | 62 | 63 | 64 | 65 | 66 | 67 | 68 | 69 | 70 | 71 | 72 | 73 | 74 | 75 | 76 | 77 | 78 | 79 | 80 | 81 | 82 | 83 | 84 | 85 | 86 | 87 | 88 | 98 | 90 | 91 | 92 | 93 | 94 | 95 | 96 | 129 | 97 | 98 | 99 | 100 | 101 | 102 | 103 | 104 | 105 | 106 | 107 | 108 | 109 | 110 | 111 | 112 | 113 | 114 | 115 | 116 | 117 | 118 | 119 | 129 | 120 | 121 | 122 | 123 | 124 | 125 | 126 | 127 | 128
- pp | pp
- BRK5
- https://github.com/emu-russia/breaks/blob/master/BreakingNESWiki_DeepL/6502/decoder.md
  10:decoder

## Sheet 12 of 29
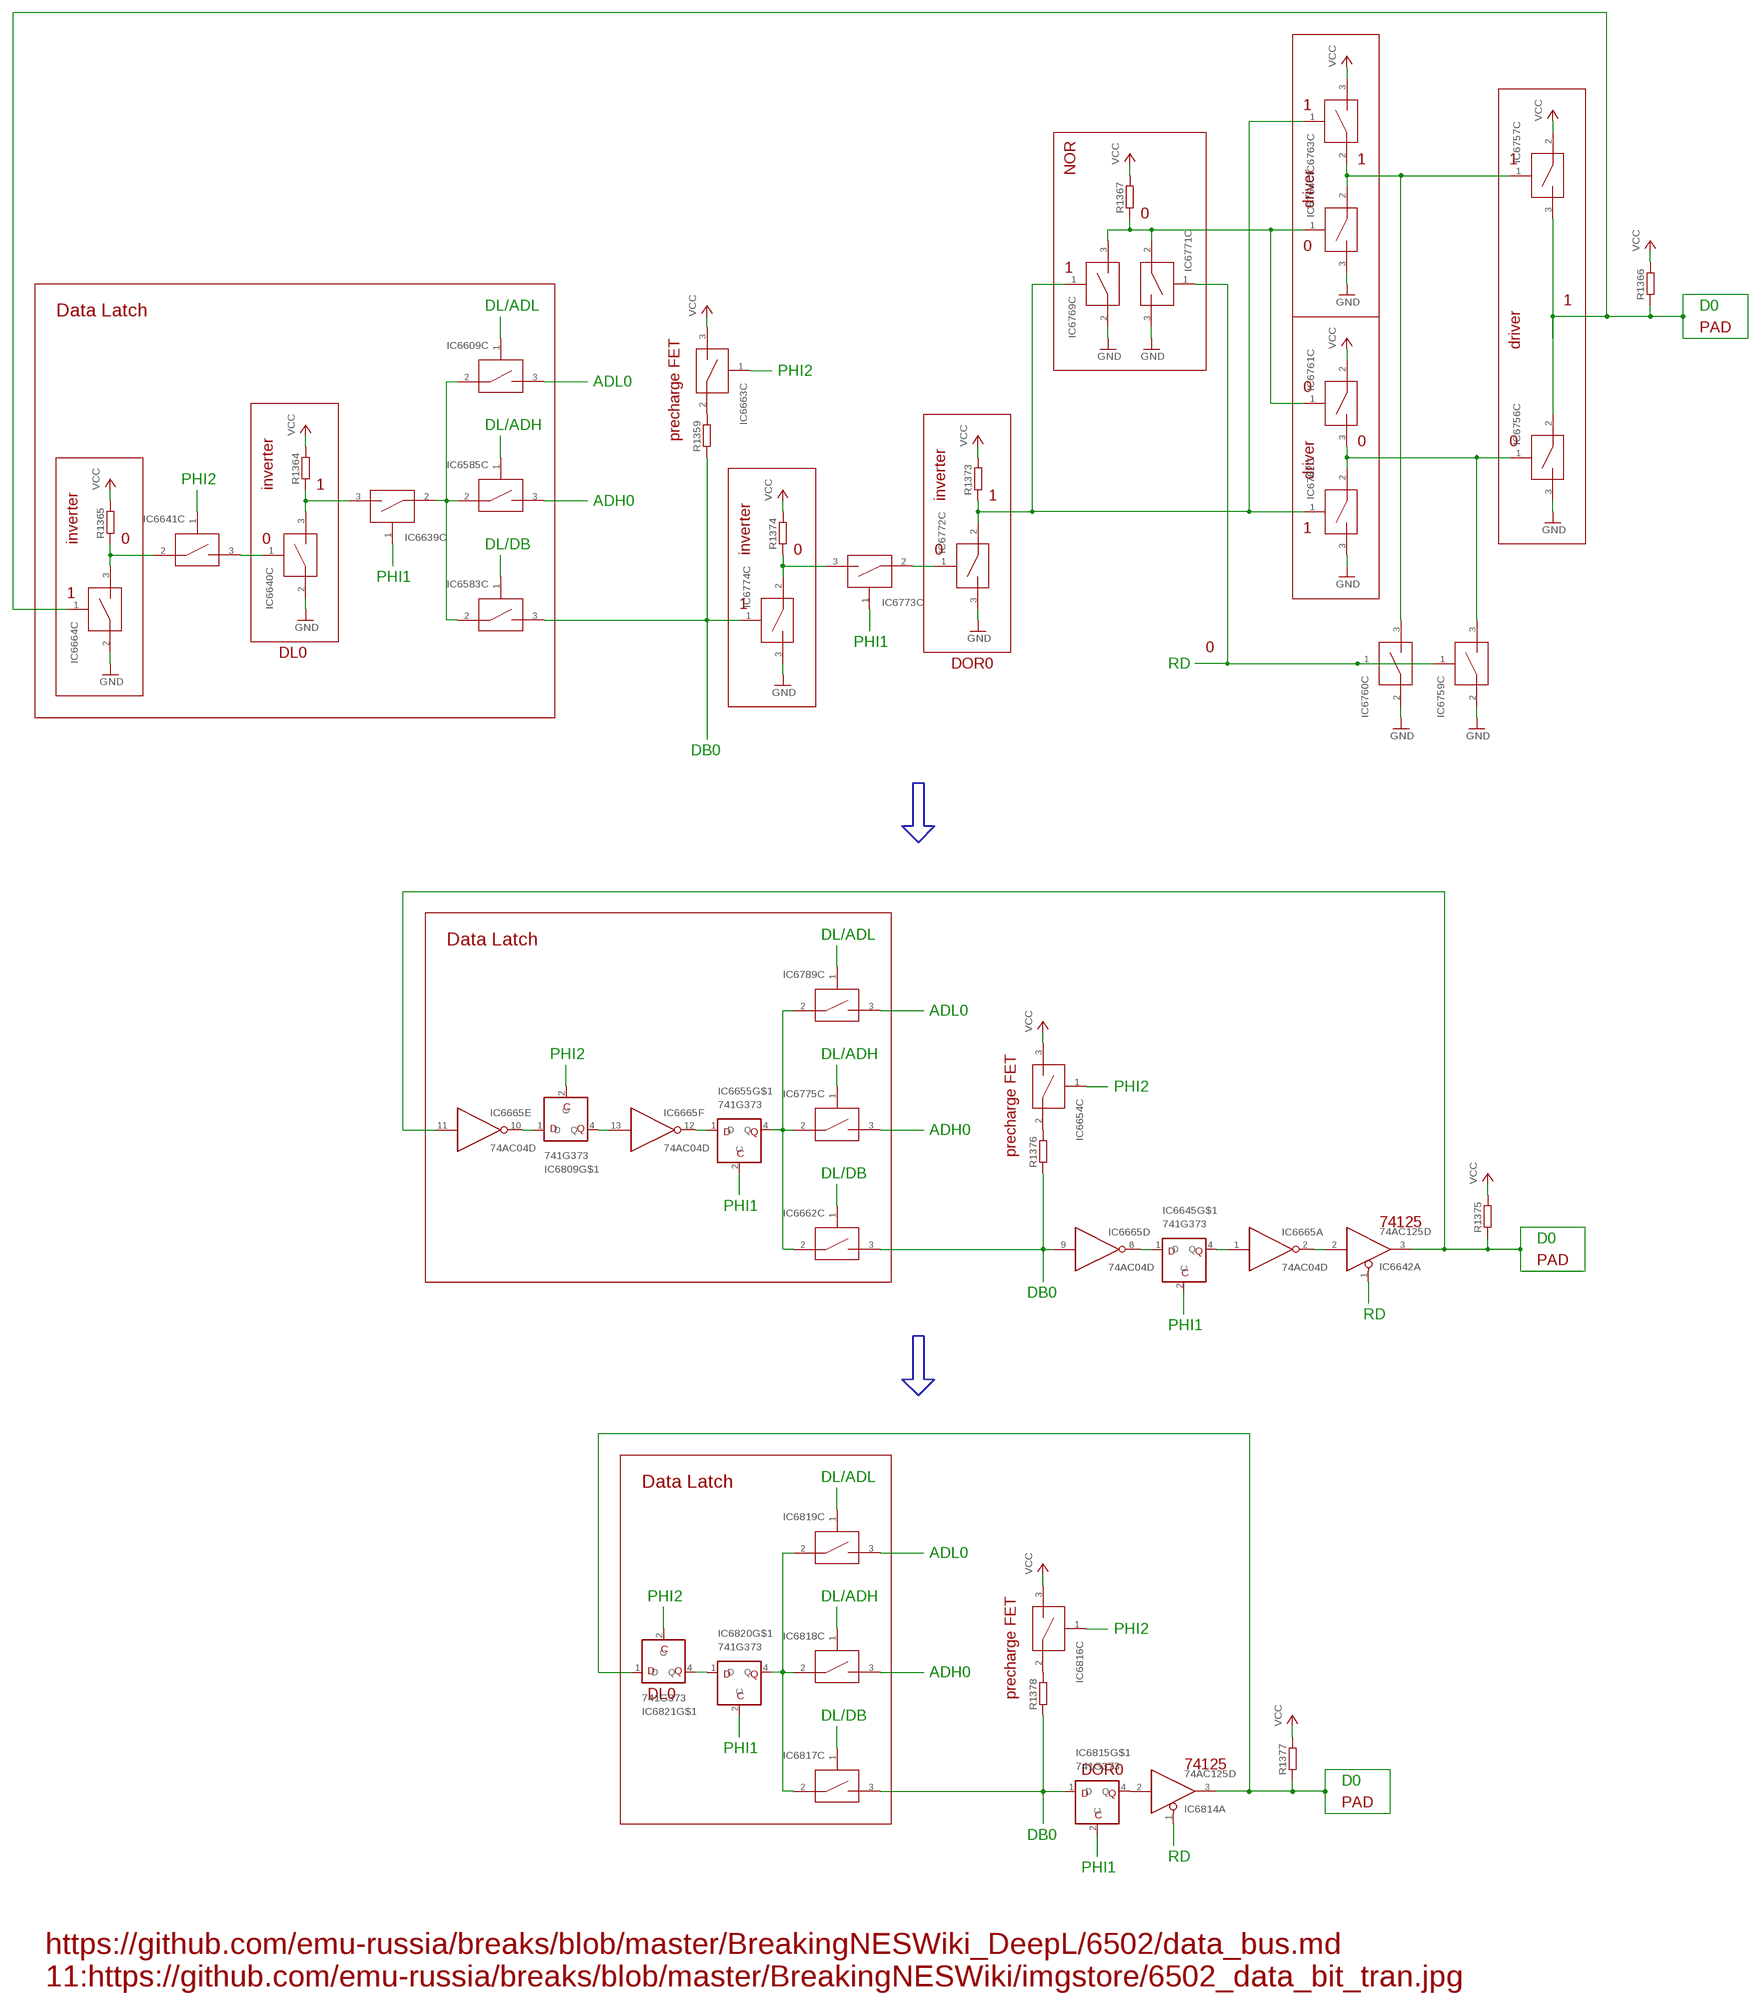
[diagram p13: schematic, sheet 12]

### Parts
IC6583  MAX4613SO16  [SO16]
IC6585  MAX4613SO16  [SO16]
IC6609  MAX4613SO16  [SO16]
IC6639  MAX4613SO16  [SO16]
IC6640  MAX4613SO16  [SO16]
IC6641  MAX4613SO16  [SO16]
IC6642  74AC125D  [SO14]
IC6645  741G373  [DBV-R-PDSO-G5]
IC6654  MAX4613SO16  [SO16]
IC6655  741G373  [DBV-R-PDSO-G5]
IC6662  MAX4613SO16  [SO16]
IC6663  MAX4613SO16  [SO16]
IC6664  MAX4613SO16  [SO16]
IC6665  74AC04D  [SO14]
IC6756  MAX4613SO16  [SO16]
IC6757  MAX4613SO16  [SO16]
IC6759  MAX4613SO16  [SO16]
IC6760  MAX4613SO16  [SO16]
IC6761  MAX4613SO16  [SO16]
IC6762  MAX4613SO16  [SO16]
IC6763  MAX4613SO16  [SO16]
IC6764  MAX4613SO16  [SO16]
IC6769  MAX4613SO16  [SO16]
IC6771  MAX4613SO16  [SO16]
IC6772  MAX4613SO16  [SO16]
IC6773  MAX4613SO16  [SO16]
IC6774  MAX4613SO16  [SO16]
IC6775  MAX4613SO16  [SO16]
IC6789  MAX4613SO16  [SO16]
IC6809  741G373  [DBV-R-PDSO-G5]
IC6814  74AC125D  [SO14]
IC6815  741G373  [DBV-R-PDSO-G5]
IC6816  MAX4613SO16  [SO16]
IC6817  MAX4613SO16  [SO16]
IC6818  MAX4613SO16  [SO16]
IC6819  MAX4613SO16  [SO16]
IC6820  741G373  [DBV-R-PDSO-G5]
IC6821  741G373  [DBV-R-PDSO-G5]
R1359  R-EU_R0603  [R0603]
R1364  R-EU_R0603  [R0603]
R1365  R-EU_R0603  [R0603]
R1366  R-EU_R0603  [R0603]
R1367  R-EU_R0603  [R0603]
R1373  R-EU_R0603  [R0603]
R1374  R-EU_R0603  [R0603]
R1375  R-EU_R0603  [R0603]
R1376  R-EU_R0603  [R0603]
R1377  R-EU_R0603  [R0603]
R1378  R-EU_R0603  [R0603]

### Nets
GND: IC6640.2 IC6664.2 IC6756.3 IC6759.2 IC6760.2 IC6762.3 IC6764.3 IC6769.2 IC6771.3 IC6772.3 IC6774.3 ; also sheet 1,2,3,4,9,10,11,13,14,19,20,21,22,23
N$12014: IC6663.2 R1359.2
N$12017: IC6585.1
N$12018: IC6583.1
N$12021: IC6609.1
N$12243: IC6585.3
N$12244: IC6609.3
N$12245: IC6583.2 IC6585.2 IC6609.2 IC6639.2
N$12256: IC6639.1
N$12257: IC6639.3 IC6640.3 R1364.1
N$12258: IC6663.1
N$12259: IC6641.1
N$12260: IC6640.1 IC6641.3
N$12261: IC6641.2 IC6664.3 R1365.1
N$12286: IC6761.1 IC6764.1 IC6769.3 IC6771.2 R1367.1
N$12287: IC6664.1 IC6756.2 IC6757.3 R1366.1
N$12288: IC6759.1 IC6760.1 IC6771.1
N$12289: IC6762.1 IC6763.1 IC6769.1 IC6772.2 R1373.1
N$12290: IC6757.1 IC6760.3 IC6763.2 IC6764.2
N$12291: IC6756.1 IC6759.3 IC6761.3 IC6762.2
N$12292: IC6773.1
N$12293: IC6772.1 IC6773.2
N$12294: IC6773.3 IC6774.2 R1374.1
N$12295: IC6583.3 IC6774.1 R1359.1
N$12327: IC6655.2(C)
N$12404: IC6645.2(C)
N$12407: IC6642.1(A:OE)
N$12414: IC6645.4(Q) IC6665.1(A:I)
N$12415: IC6642.2(A:I) IC6665.2(A:O)
N$12416: IC6645.1(D) IC6665.8(D:O)
N$12427: IC6654.1
N$12428: IC6809.2(C)
N$12429: IC6654.2 R1376.2
N$12430: IC6665.10(E:O) IC6809.1(D)
N$12431: IC6642.3(A:O) IC6665.11(E:I) R1375.1
N$12432: IC6662.3 IC6665.9(D:I) R1376.1
N$12433: IC6775.1
N$12434: IC6662.1
N$12435: IC6789.1
N$12436: IC6775.3
N$12437: IC6789.3
N$12438: IC6655.4(Q) IC6662.2 IC6775.2 IC6789.2
N$12439: IC6815.2(C)
N$12440: IC6655.1(D) IC6665.12(F:O)
N$12441: IC6814.1(A:OE)
N$12442: IC6665.13(F:I) IC6809.4(Q)
N$12444: IC6814.2(A:I) IC6815.4(Q)
N$12446: IC6816.1
N$12447: IC6816.2 R1378.2
N$12449: IC6814.3(A:O) IC6821.1(D) R1377.1
N$12482: IC6815.1(D) IC6817.3 R1378.1
N$12483: IC6818.1
N$12484: IC6817.1
N$12498: IC6819.1
N$12499: IC6818.3
N$12500: IC6819.3
N$12501: IC6817.2 IC6818.2 IC6819.2 IC6820.4(Q)
N$12502: IC6820.1(D) IC6821.4(Q)
N$12504: IC6820.2(C)
N$12505: IC6821.2(C)
VCC: IC6654.3 IC6663.3 IC6757.2 IC6761.2 IC6763.3 IC6816.3 R1364.2 R1365.2 R1366.2 R1367.2 R1373.2 R1374.2 R1375.2 R1377.2 ; also sheet 1,2,3,4,9,11,13,19,20,21,22,23,26
Unconnected: IC6583.4(PWR:V-) IC6583.5(PWR:GND) IC6583.6 IC6583.7 IC6583.8 IC6583.9 IC6583.10 IC6583.11 IC6583.12(PWR:VCC) IC6583.13(PWR:V+) IC6583.14 IC6583.15 IC6583.16 IC6585.4(PWR:V-) IC6585.5(PWR:GND) IC6585.6 IC6585.7 IC6585.8 IC6585.9 IC6585.10 IC6585.11 IC6585.12(PWR:VCC) IC6585.13(PWR:V+) IC6585.14 IC6585.15 IC6585.16 IC6609.4(PWR:V-) IC6609.5(PWR:GND) IC6609.6 IC6609.7 IC6609.8 IC6609.9 IC6609.10 IC6609.11 IC6609.12(PWR:VCC) IC6609.13(PWR:V+) IC6609.14 IC6609.15 IC6609.16 IC6639.4(PWR:V-) IC6639.5(PWR:GND) IC6639.6 IC6639.7 IC6639.8 IC6639.9 IC6639.10 IC6639.11 IC6639.12(PWR:VCC) IC6639.13(PWR:V+) IC6639.14 IC6639.15 IC6639.16 IC6640.4(PWR:V-) IC6640.5(PWR:GND) IC6640.6 IC6640.7 IC6640.8 IC6640.9 IC6640.10 IC6640.11 IC6640.12(PWR:VCC) IC6640.13(PWR:V+) IC6640.14 IC6640.15 IC6640.16 IC6641.4(PWR:V-) IC6641.5(PWR:GND) IC6641.6 IC6641.7 IC6641.8 IC6641.9 IC6641.10 IC6641.11 IC6641.12(PWR:VCC) IC6641.13(PWR:V+) IC6641.14 IC6641.15 IC6641.16 IC6642.4(B:OE) IC6642.5(B:I) IC6642.6(B:O) IC6642.8(C:O) IC6642.9(C:I) IC6642.10(C:OE) IC6642.11(D:O) IC6642.12(D:I) IC6642.13(D:OE) IC6654.4(PWR:V-) IC6654.5(PWR:GND) IC6654.6 IC6654.7 IC6654.8 IC6654.9 IC6654.10 IC6654.11 IC6654.12(PWR:VCC) IC6654.13(PWR:V+) IC6654.14 IC6654.15 IC6654.16 IC6662.4(PWR:V-) IC6662.5(PWR:GND) IC6662.6 IC6662.7 IC6662.8 IC6662.9 IC6662.10 IC6662.11 IC6662.12(PWR:VCC) IC6662.13(PWR:V+) IC6662.14 IC6662.15 IC6662.16 IC6663.4(PWR:V-) IC6663.5(PWR:GND) IC6663.6 IC6663.7 IC6663.8 IC6663.9 IC6663.10 IC6663.11 IC6663.12(PWR:VCC) IC6663.13(PWR:V+) IC6663.14 IC6663.15 IC6663.16 IC6664.4(PWR:V-) IC6664.5(PWR:GND) IC6664.6 IC6664.7 IC6664.8 IC6664.9 IC6664.10 IC6664.11 IC6664.12(PWR:VCC) IC6664.13(PWR:V+) IC6664.14 IC6664.15 IC6664.16 IC6665.3(B:I) IC6665.4(B:O) IC6665.5(C:I) IC6665.6(C:O) IC6756.4(PWR:V-) IC6756.5(PWR:GND) IC6756.6 IC6756.7 IC6756.8 IC6756.9 IC6756.10 IC6756.11 IC6756.12(PWR:VCC) IC6756.13(PWR:V+) IC6756.14 IC6756.15 IC6756.16 IC6757.4(PWR:V-) IC6757.5(PWR:GND) IC6757.6 IC6757.7 IC6757.8 IC6757.9 IC6757.10 IC6757.11 IC6757.12(PWR:VCC) IC6757.13(PWR:V+) IC6757.14 IC6757.15 IC6757.16 IC6759.4(PWR:V-) IC6759.5(PWR:GND) IC6759.6 IC6759.7 IC6759.8 IC6759.9 IC6759.10 IC6759.11 IC6759.12(PWR:VCC) IC6759.13(PWR:V+) IC6759.14 IC6759.15 IC6759.16 IC6760.4(PWR:V-) IC6760.5(PWR:GND) IC6760.6 IC6760.7 IC6760.8 IC6760.9 IC6760.10 IC6760.11 IC6760.12(PWR:VCC) IC6760.13(PWR:V+) IC6760.14 IC6760.15 IC6760.16 IC6761.4(PWR:V-) IC6761.5(PWR:GND) IC6761.6 IC6761.7 IC6761.8 IC6761.9 IC6761.10 IC6761.11 IC6761.12(PWR:VCC) IC6761.13(PWR:V+) IC6761.14 IC6761.15 IC6761.16 IC6762.4(PWR:V-) IC6762.5(PWR:GND) IC6762.6 IC6762.7 IC6762.8 IC6762.9 IC6762.10 IC6762.11 IC6762.12(PWR:VCC) IC6762.13(PWR:V+) IC6762.14 IC6762.15 IC6762.16 IC6763.4(PWR:V-) IC6763.5(PWR:GND) IC6763.6 IC6763.7 IC6763.8 IC6763.9 IC6763.10 IC6763.11 IC6763.12(PWR:VCC) IC6763.13(PWR:V+) IC6763.14 IC6763.15 IC6763.16 IC6764.4(PWR:V-) IC6764.5(PWR:GND) IC6764.6 IC6764.7 IC6764.8 IC6764.9 IC6764.10 IC6764.11 IC6764.12(PWR:VCC) IC6764.13(PWR:V+) IC6764.14 IC6764.15 IC6764.16 IC6769.4(PWR:V-) IC6769.5(PWR:GND) IC6769.6 IC6769.7 IC6769.8 IC6769.9 IC6769.10 IC6769.11 IC6769.12(PWR:VCC) IC6769.13(PWR:V+) IC6769.14 IC6769.15 IC6769.16 IC6771.4(PWR:V-) IC6771.5(PWR:GND) IC6771.6 IC6771.7 IC6771.8 IC6771.9 IC6771.10 IC6771.11 IC6771.12(PWR:VCC) IC6771.13(PWR:V+) IC6771.14 IC6771.15 IC6771.16 IC6772.4(PWR:V-) IC6772.5(PWR:GND) IC6772.6 IC6772.7 IC6772.8 IC6772.9 IC6772.10 IC6772.11 IC6772.12(PWR:VCC) IC6772.13(PWR:V+) IC6772.14 IC6772.15 IC6772.16 IC6773.4(PWR:V-) IC6773.5(PWR:GND) IC6773.6 IC6773.7 IC6773.8 IC6773.9 IC6773.10 IC6773.11 IC6773.12(PWR:VCC) IC6773.13(PWR:V+) IC6773.14 IC6773.15 IC6773.16 IC6774.4(PWR:V-) IC6774.5(PWR:GND) IC6774.6 IC6774.7 IC6774.8 IC6774.9 IC6774.10 IC6774.11 IC6774.12(PWR:VCC) IC6774.13(PWR:V+) IC6774.14 IC6774.15 IC6774.16 IC6775.4(PWR:V-) IC6775.5(PWR:GND) IC6775.6 IC6775.7 IC6775.8 IC6775.9 IC6775.10 IC6775.11 IC6775.12(PWR:VCC) IC6775.13(PWR:V+) IC6775.14 IC6775.15 IC6775.16 IC6789.4(PWR:V-) IC6789.5(PWR:GND) IC6789.6 IC6789.7 IC6789.8 IC6789.9 IC6789.10 IC6789.11 IC6789.12(PWR:VCC) IC6789.13(PWR:V+) IC6789.14 IC6789.15 IC6789.16 IC6814.4(B:OE) IC6814.5(B:I) IC6814.6(B:O) IC6814.8(C:O) IC6814.9(C:I) IC6814.10(C:OE) IC6814.11(D:O) IC6814.12(D:I) IC6814.13(D:OE) IC6816.4(PWR:V-) IC6816.5(PWR:GND) IC6816.6 IC6816.7 IC6816.8 IC6816.9 IC6816.10 IC6816.11 IC6816.12(PWR:VCC) IC6816.13(PWR:V+) IC6816.14 IC6816.15 IC6816.16 IC6817.4(PWR:V-) IC6817.5(PWR:GND) IC6817.6 IC6817.7 IC6817.8 IC6817.9 IC6817.10 IC6817.11 IC6817.12(PWR:VCC) IC6817.13(PWR:V+) IC6817.14 IC6817.15 IC6817.16 IC6818.4(PWR:V-) IC6818.5(PWR:GND) IC6818.6 IC6818.7 IC6818.8 IC6818.9 IC6818.10 IC6818.11 IC6818.12(PWR:VCC) IC6818.13(PWR:V+) IC6818.14 IC6818.15 IC6818.16 IC6819.4(PWR:V-) IC6819.5(PWR:GND) IC6819.6 IC6819.7 IC6819.8 IC6819.9 IC6819.10 IC6819.11 IC6819.12(PWR:VCC) IC6819.13(PWR:V+) IC6819.14 IC6819.15 IC6819.16

### Buses
B$12

### Notes on the sheet
- 1
- 1 | 1
- NOR
- driver
- 0
- 0
- 1
- 1
- DL/ADL | D0
- Data Latch
- PAD
- driver
- PHI2
- ADL0
- 0
- DL/ADH
- precharge FET
- 0 | 0
- driver
- PHI2
- inverter | 1
- inverter | 1
- ADH0
- 1
- inverter | 0 | 0
- DL/DB
- inverter | 0 | 0
- PHI1
- 1
- 1
- PHI1
- 0
- DL0
- DOR0 | RD
- DB0
- DL/ADL
- Data Latch
- ADL0
- PHI2 | DL/ADH
- PHI2
- ADH0
- precharge FET
- DL/DB
- PHI1
- 74125
- D0
- PAD
- DB0
- RD
- PHI1
- DL/ADL
- Data Latch
- ADL0
- PHI2 | DL/ADH
- PHI2
- ADH0
- DL0 | precharge FET
- DL/DB
- PHI1
- 74125
- DOR0
- D0
- PAD
- DB0
- RD
- PHI1
- https://github.com/emu-russia/breaks/blob/master/BreakingNESWiki_DeepL/6502/data_bus.md
  11:https://github.com/emu-russia/breaks/blob/master/BreakingNESWiki/imgstore/6502_data_bit_tran.jpg

## Sheet 13 of 29
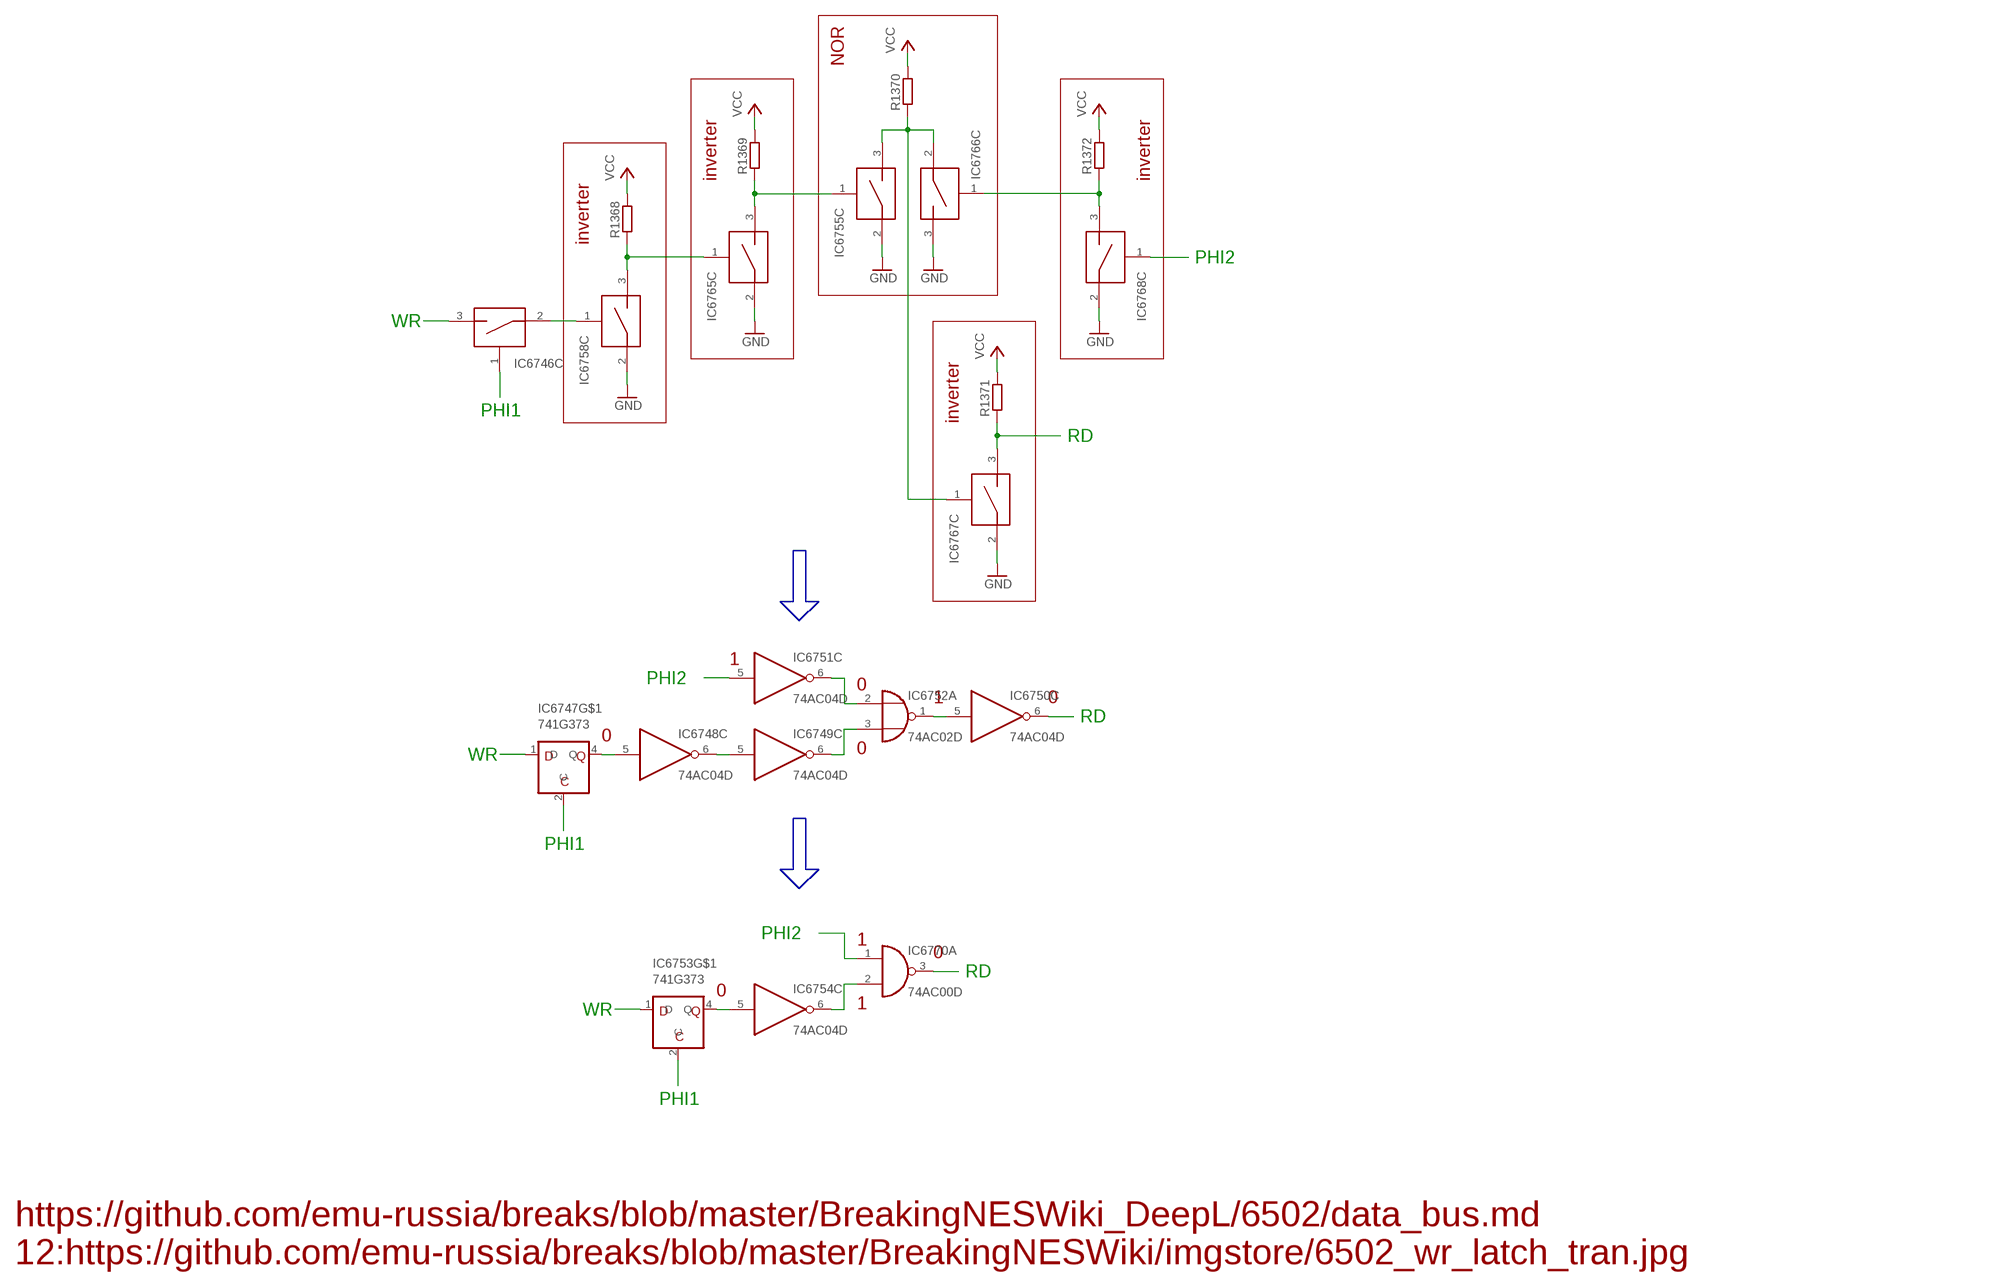
[diagram p14: schematic, sheet 13]

### Parts
IC6746  MAX4613SO16  [SO16]
IC6747  741G373  [DBV-R-PDSO-G5]
IC6748  74AC04D  [SO14]
IC6749  74AC04D  [SO14]
IC6750  74AC04D  [SO14]
IC6751  74AC04D  [SO14]
IC6752  74AC02D  [SO14]
IC6753  741G373  [DBV-R-PDSO-G5]
IC6754  74AC04D  [SO14]
IC6755  MAX4613SO16  [SO16]
IC6758  MAX4613SO16  [SO16]
IC6765  MAX4613SO16  [SO16]
IC6766  MAX4613SO16  [SO16]
IC6767  MAX4613SO16  [SO16]
IC6768  MAX4613SO16  [SO16]
IC6770  74AC00D  [SO14]
R1368  R-EU_R0603  [R0603]
R1369  R-EU_R0603  [R0603]
R1370  R-EU_R0603  [R0603]
R1371  R-EU_R0603  [R0603]
R1372  R-EU_R0603  [R0603]

### Nets
GND: IC6755.2 IC6758.2 IC6765.2 IC6766.3 IC6767.2 IC6768.2 ; also sheet 1,2,3,4,9,10,11,12,14,19,20,21,22,23
N$12272: IC6746.2 IC6758.1
N$12273: IC6746.1
N$12274: IC6747.2(C)
N$12276: IC6747.1(D)
N$12277: IC6750.5(C:I) IC6752.1(A:O)
N$12278: IC6750.6(C:O)
N$12279: IC6755.3 IC6766.2 IC6767.1 R1370.1
N$12280: IC6747.4(Q) IC6748.5(C:I)
N$12281: IC6746.3
N$12282: IC6748.6(C:O) IC6749.5(C:I)
N$12283: IC6749.6(C:O) IC6752.3(A:I1)
N$12284: IC6758.3 IC6765.1 R1368.1
N$12285: IC6751.6(C:O) IC6752.2(A:I0)
N$12296: IC6755.1 IC6765.3 R1369.1
N$12297: IC6767.3 R1371.1
N$12298: IC6768.1
N$12299: IC6766.1 IC6768.3 R1372.1
N$12300: IC6751.5(C:I)
N$12301: IC6753.2(C)
N$12325: IC6753.1(D)
N$12329: IC6770.3(A:O)
N$12403: IC6753.4(Q) IC6754.5(C:I)
N$12405: IC6754.6(C:O) IC6770.2(A:I1)
N$12406: IC6770.1(A:I0)
VCC: R1368.2 R1369.2 R1370.2 R1371.2 R1372.2 ; also sheet 1,2,3,4,9,11,12,19,20,21,22,23,26
Unconnected: IC6746.4(PWR:V-) IC6746.5(PWR:GND) IC6746.6 IC6746.7 IC6746.8 IC6746.9 IC6746.10 IC6746.11 IC6746.12(PWR:VCC) IC6746.13(PWR:V+) IC6746.14 IC6746.15 IC6746.16 IC6748.1(A:I) IC6748.2(A:O) IC6748.3(B:I) IC6748.4(B:O) IC6748.8(D:O) IC6748.9(D:I) IC6748.10(E:O) IC6748.11(E:I) IC6748.12(F:O) IC6748.13(F:I) IC6749.1(A:I) IC6749.2(A:O) IC6749.3(B:I) IC6749.4(B:O) IC6749.8(D:O) IC6749.9(D:I) IC6749.10(E:O) IC6749.11(E:I) IC6749.12(F:O) IC6749.13(F:I) IC6750.1(A:I) IC6750.2(A:O) IC6750.3(B:I) IC6750.4(B:O) IC6750.8(D:O) IC6750.9(D:I) IC6750.10(E:O) IC6750.11(E:I) IC6750.12(F:O) IC6750.13(F:I) IC6751.1(A:I) IC6751.2(A:O) IC6751.3(B:I) IC6751.4(B:O) IC6751.8(D:O) IC6751.9(D:I) IC6751.10(E:O) IC6751.11(E:I) IC6751.12(F:O) IC6751.13(F:I) IC6752.4(B:O) IC6752.5(B:I0) IC6752.6(B:I1) IC6752.8(C:I0) IC6752.9(C:I1) IC6752.10(C:O) IC6752.11(D:I0) IC6752.12(D:I1) IC6752.13(D:O) IC6754.1(A:I) IC6754.2(A:O) IC6754.3(B:I) IC6754.4(B:O) IC6754.8(D:O) IC6754.9(D:I) IC6754.10(E:O) IC6754.11(E:I) IC6754.12(F:O) IC6754.13(F:I) IC6755.4(PWR:V-) IC6755.5(PWR:GND) IC6755.6 IC6755.7 IC6755.8 IC6755.9 IC6755.10 IC6755.11 IC6755.12(PWR:VCC) IC6755.13(PWR:V+) IC6755.14 IC6755.15 IC6755.16 IC6758.4(PWR:V-) IC6758.5(PWR:GND) IC6758.6 IC6758.7 IC6758.8 IC6758.9 IC6758.10 IC6758.11 IC6758.12(PWR:VCC) IC6758.13(PWR:V+) IC6758.14 IC6758.15 IC6758.16 IC6765.4(PWR:V-) IC6765.5(PWR:GND) IC6765.6 IC6765.7 IC6765.8 IC6765.9 IC6765.10 IC6765.11 IC6765.12(PWR:VCC) IC6765.13(PWR:V+) IC6765.14 IC6765.15 IC6765.16 IC6766.4(PWR:V-) IC6766.5(PWR:GND) IC6766.6 IC6766.7 IC6766.8 IC6766.9 IC6766.10 IC6766.11 IC6766.12(PWR:VCC) IC6766.13(PWR:V+) IC6766.14 IC6766.15 IC6766.16 IC6767.4(PWR:V-) IC6767.5(PWR:GND) IC6767.6 IC6767.7 IC6767.8 IC6767.9 IC6767.10 IC6767.11 IC6767.12(PWR:VCC) IC6767.13(PWR:V+) IC6767.14 IC6767.15 IC6767.16 IC6768.4(PWR:V-) IC6768.5(PWR:GND) IC6768.6 IC6768.7 IC6768.8 IC6768.9 IC6768.10 IC6768.11 IC6768.12(PWR:VCC) IC6768.13(PWR:V+) IC6768.14 IC6768.15 IC6768.16 IC6770.4(B:I0) IC6770.5(B:I1) IC6770.6(B:O) IC6770.8(C:O) IC6770.9(C:I0) IC6770.10(C:I1) IC6770.11(D:O) IC6770.12(D:I0) IC6770.13(D:I1)

### Buses
B$12

### Notes on the sheet
- NOR
- inverter | inverter
- inverter
- PHI2
- WR
- PHI1
- inverter
- RD
- 1
- PHI2
- 0
- 1 | 0
- RD
- 0
- 0
- WR
- PHI1
- PHI2
- 1
- 0
- RD
- 0
- 1
- WR
- PHI1
- https://github.com/emu-russia/breaks/blob/master/BreakingNESWiki_DeepL/6502/data_bus.md
  12:https://github.com/emu-russia/breaks/blob/master/BreakingNESWiki/imgstore/6502_wr_latch_tran.jpg